# EasyEDA Pro project NFC-Card-D-export.epro

# Schematic NFC Card R1

## Sheets
1 01 USB and power: Assembly Variant: Basic; Board Name: Board1; Create Date: 2026-09-20; Page Name: P1; Project Name: NFC-Business-Card; Schematic Name: Schematic1; Update Date: 2026-09-20; Company: 嘉立创EDA; Page Size: A4; Version: V1.0
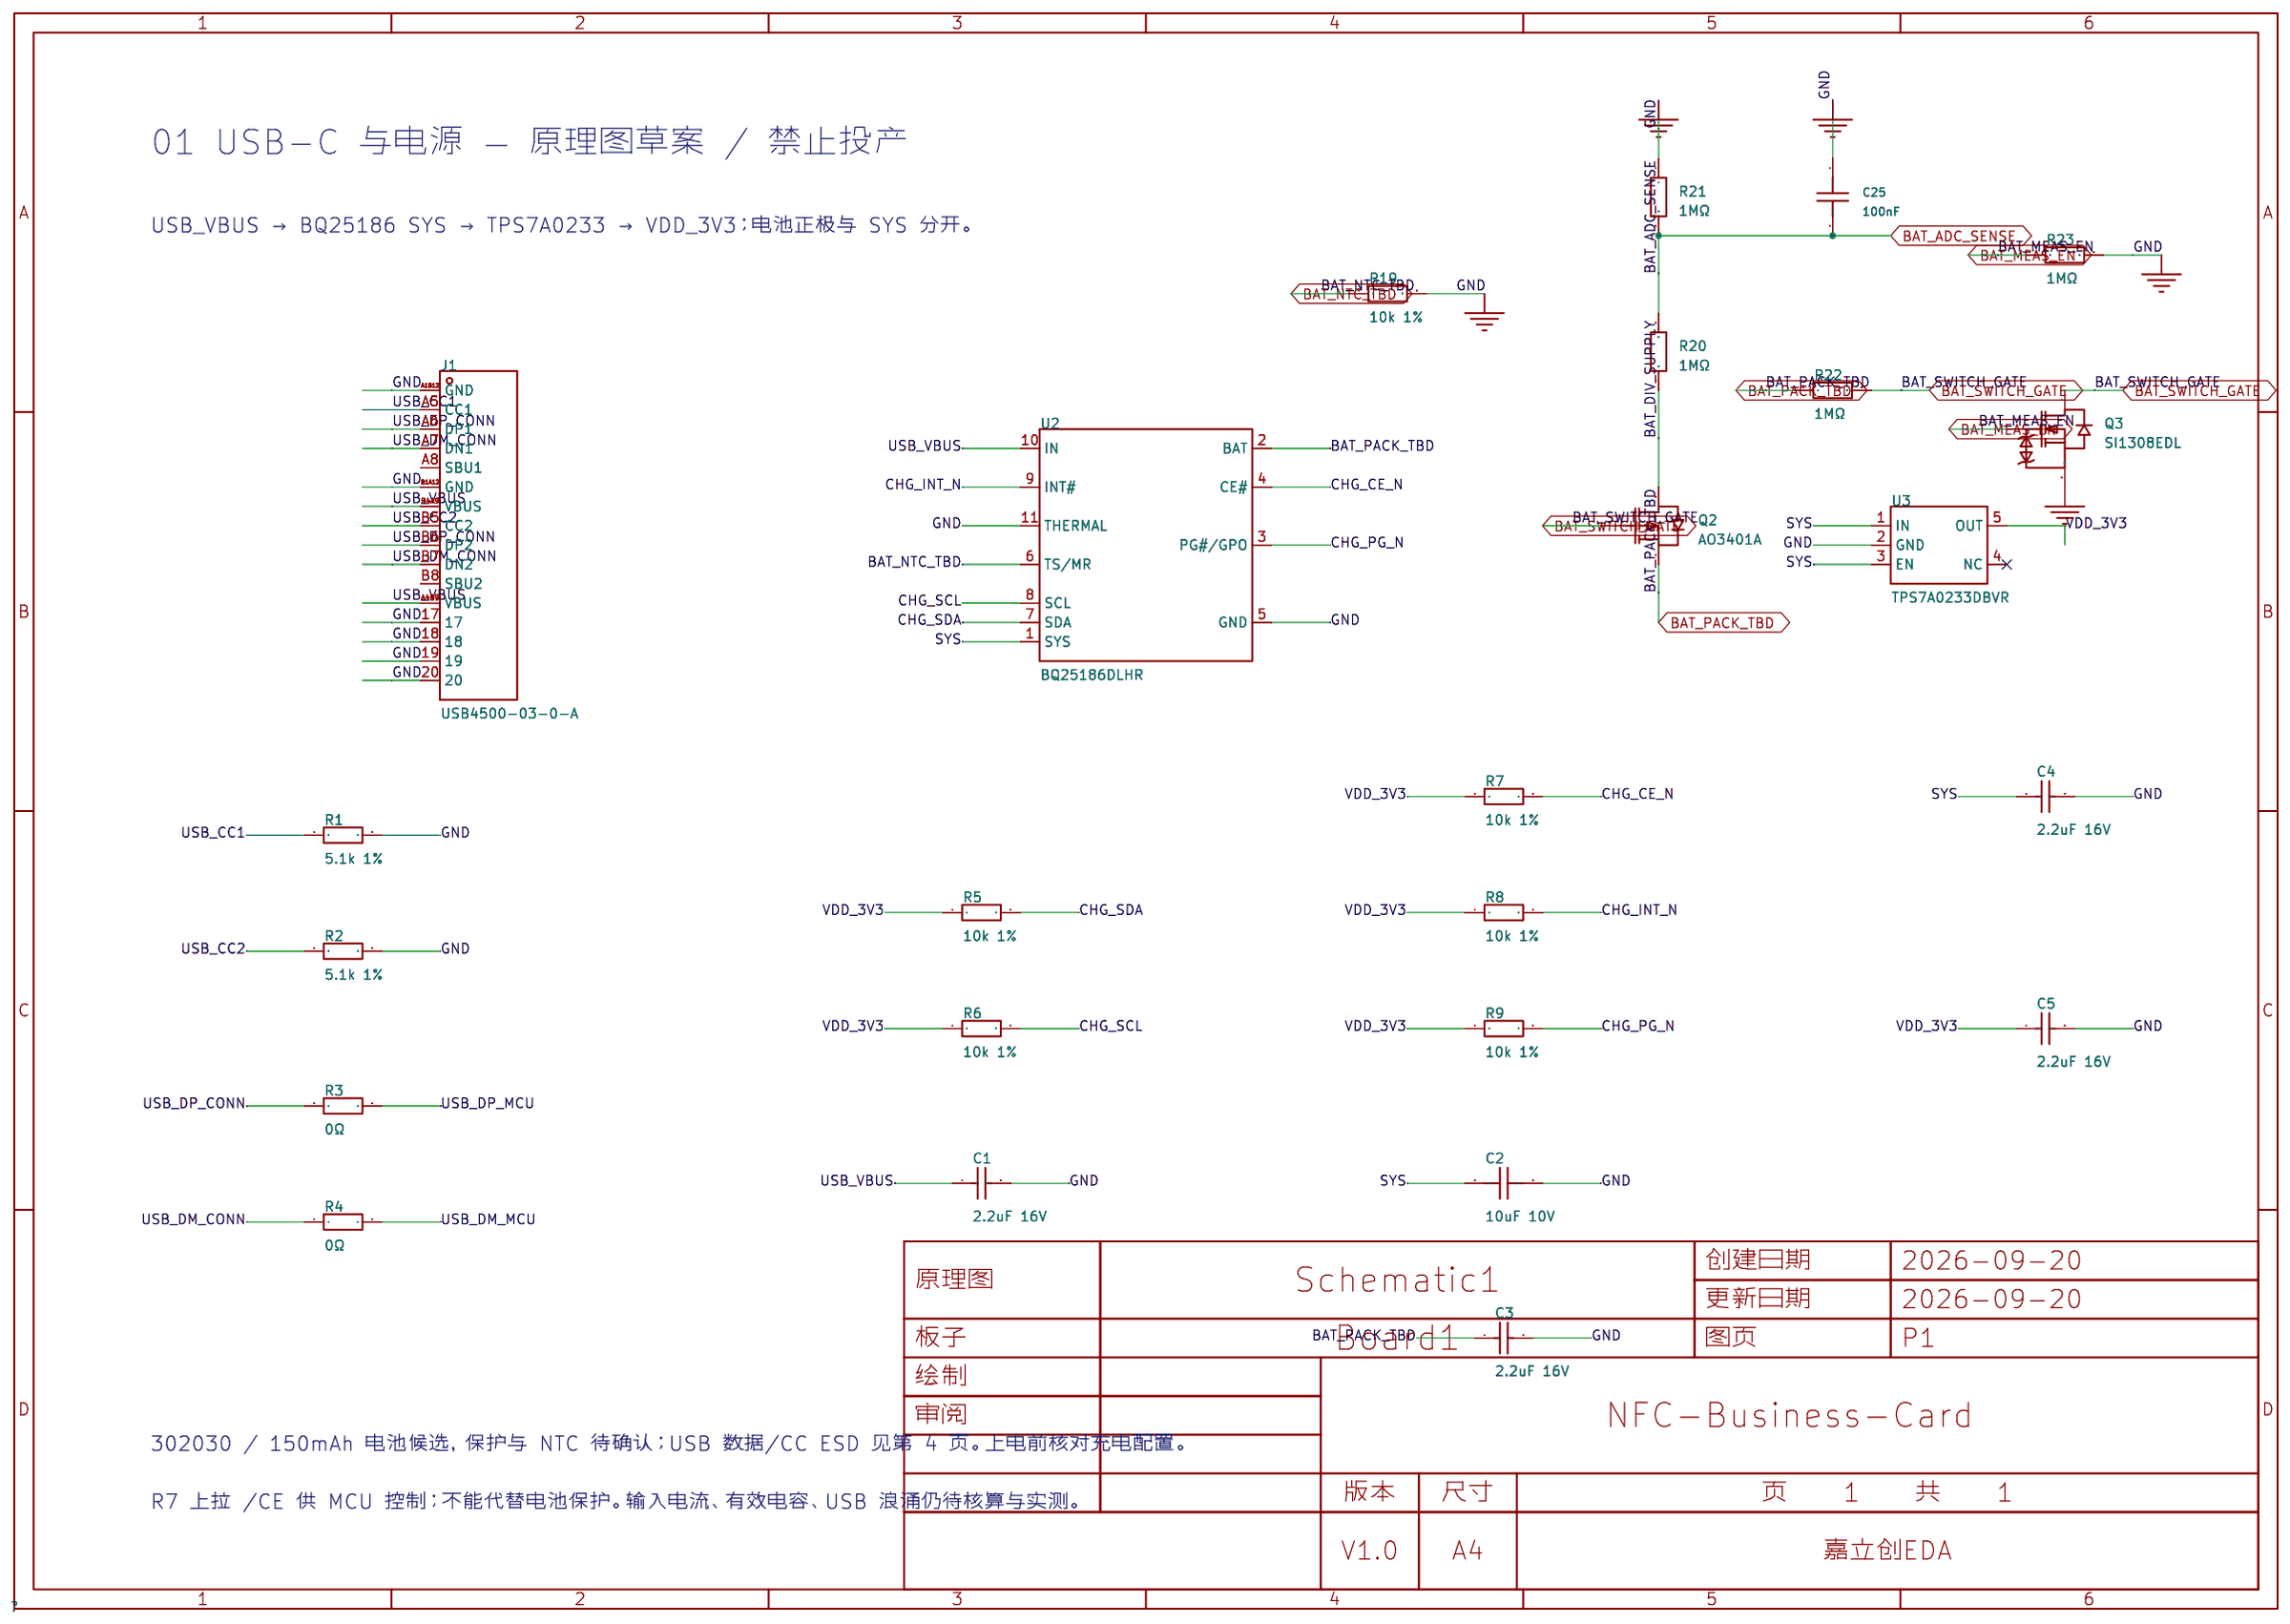
[diagram p0: 01 USB and power]
2 02 MCU and controls
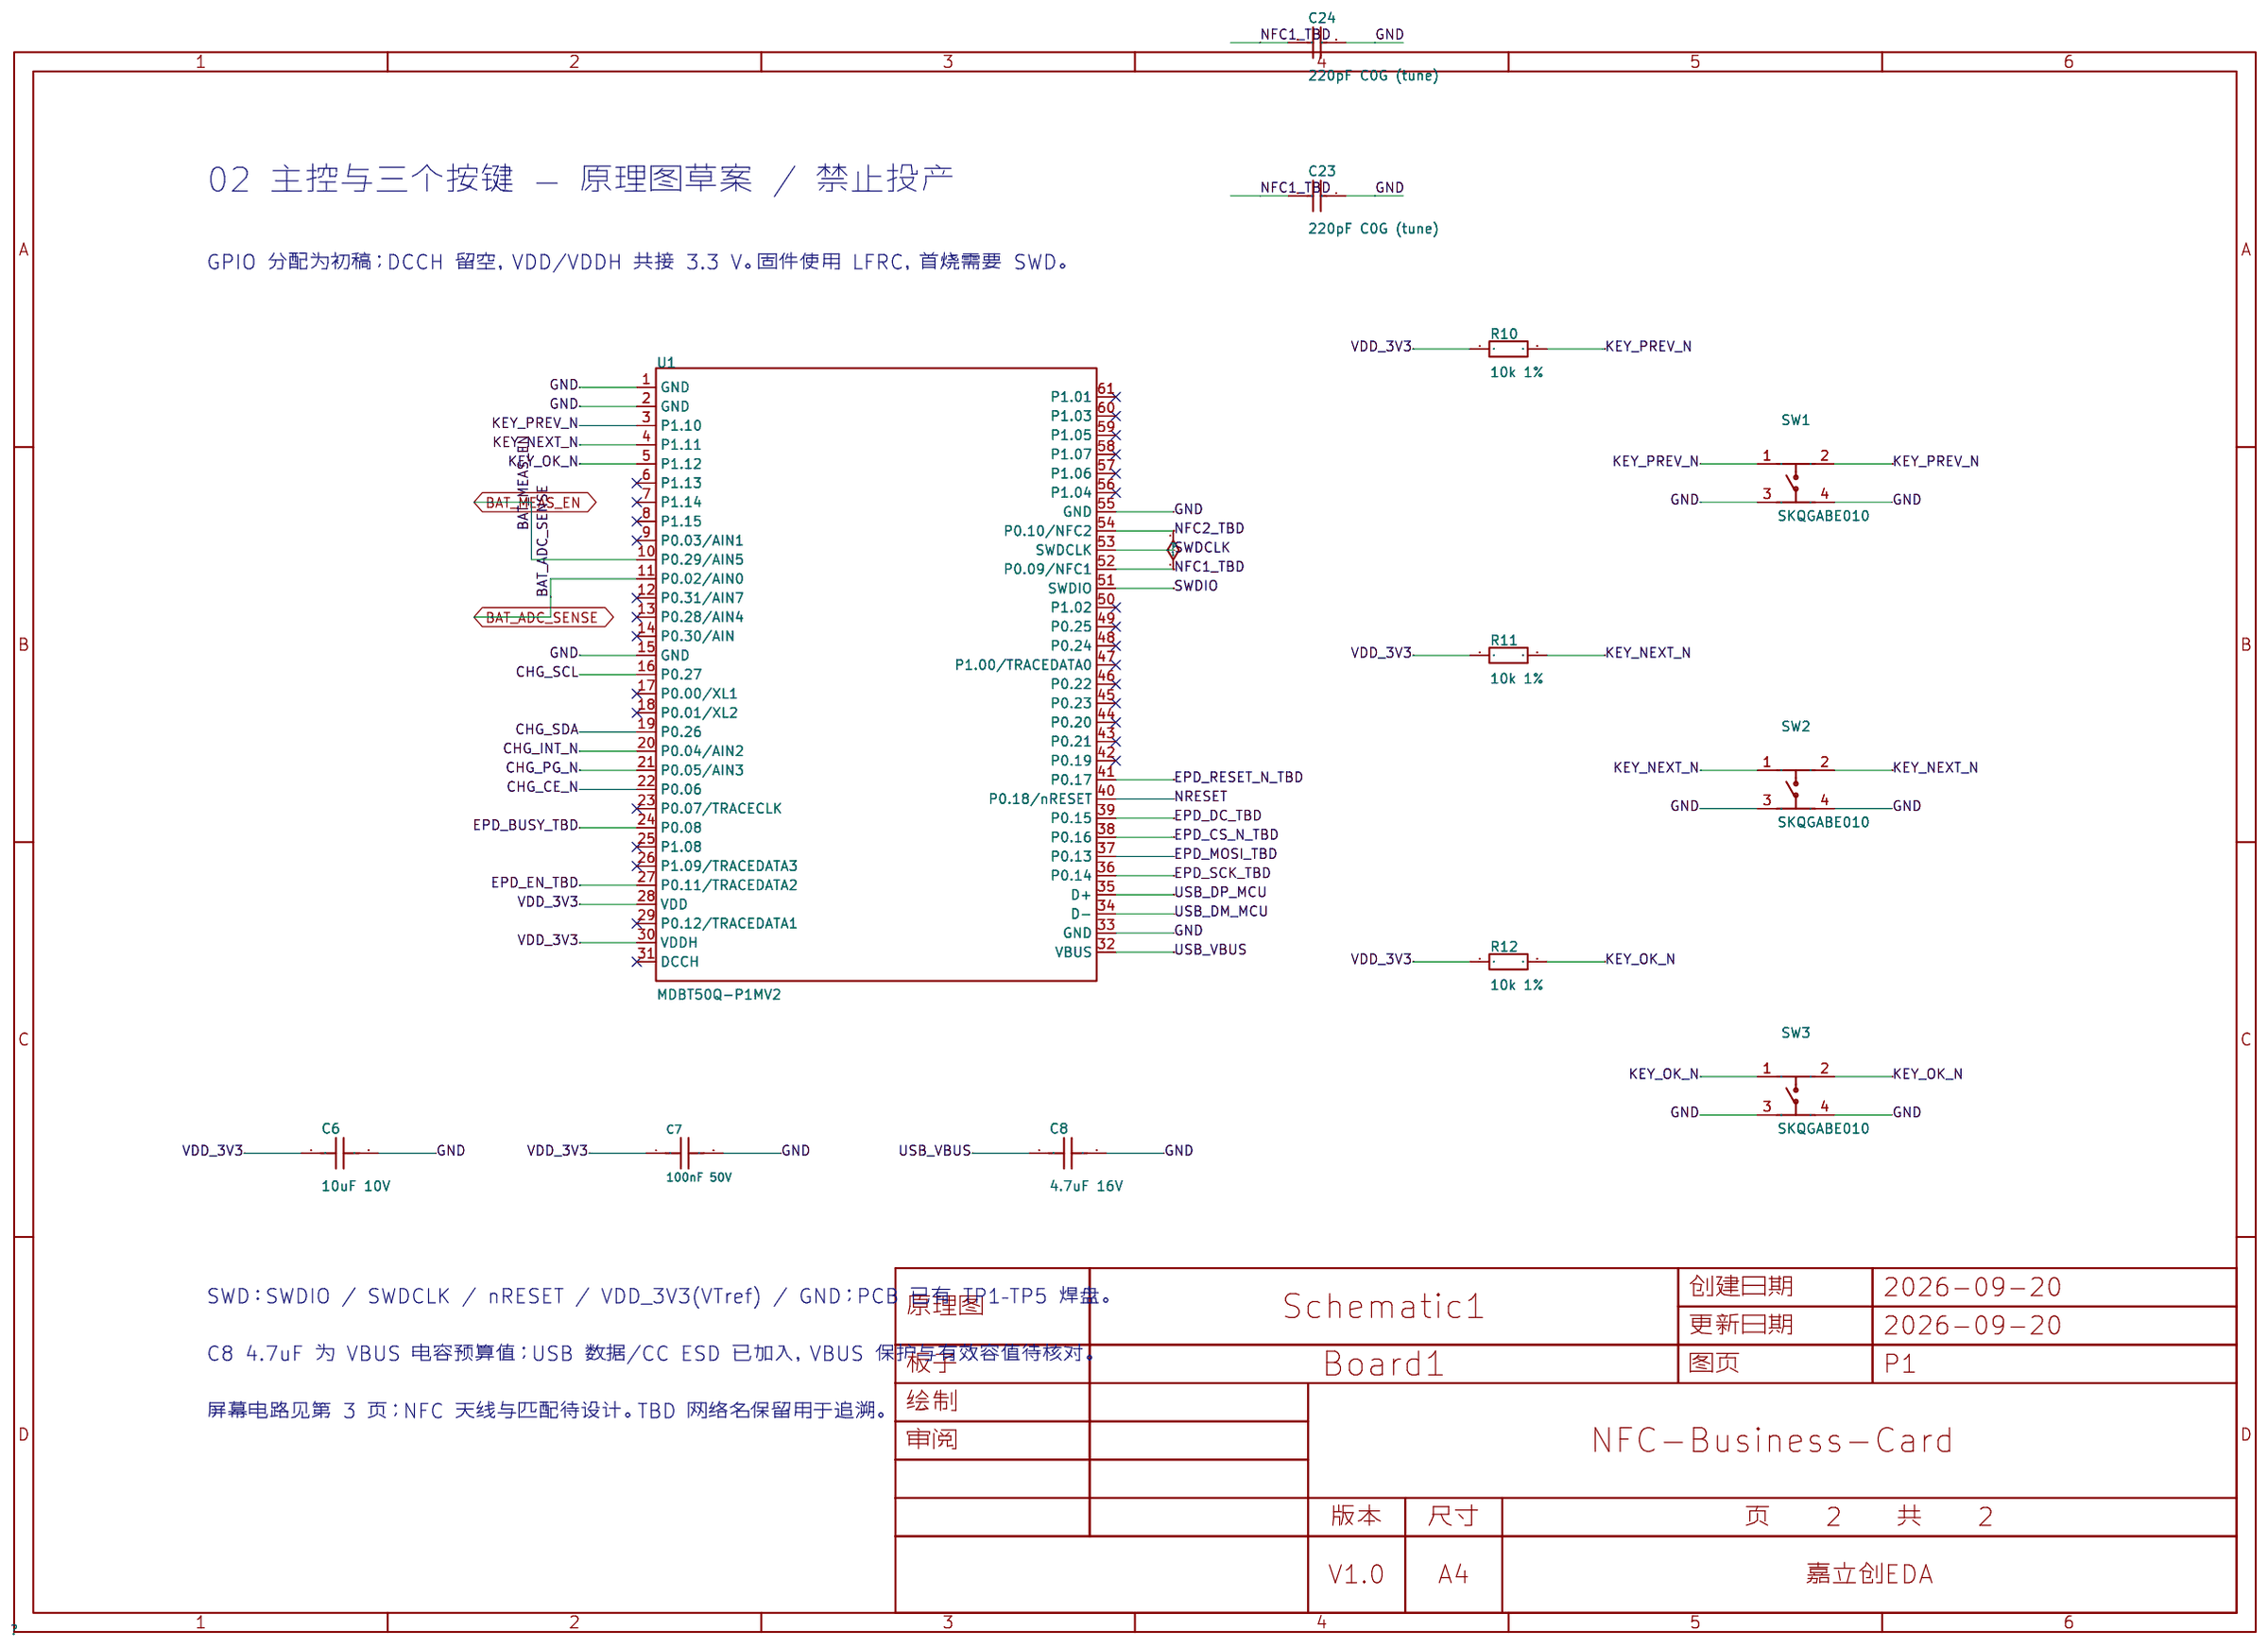
[diagram p1: 02 MCU and controls]
3 03 Display power and connector
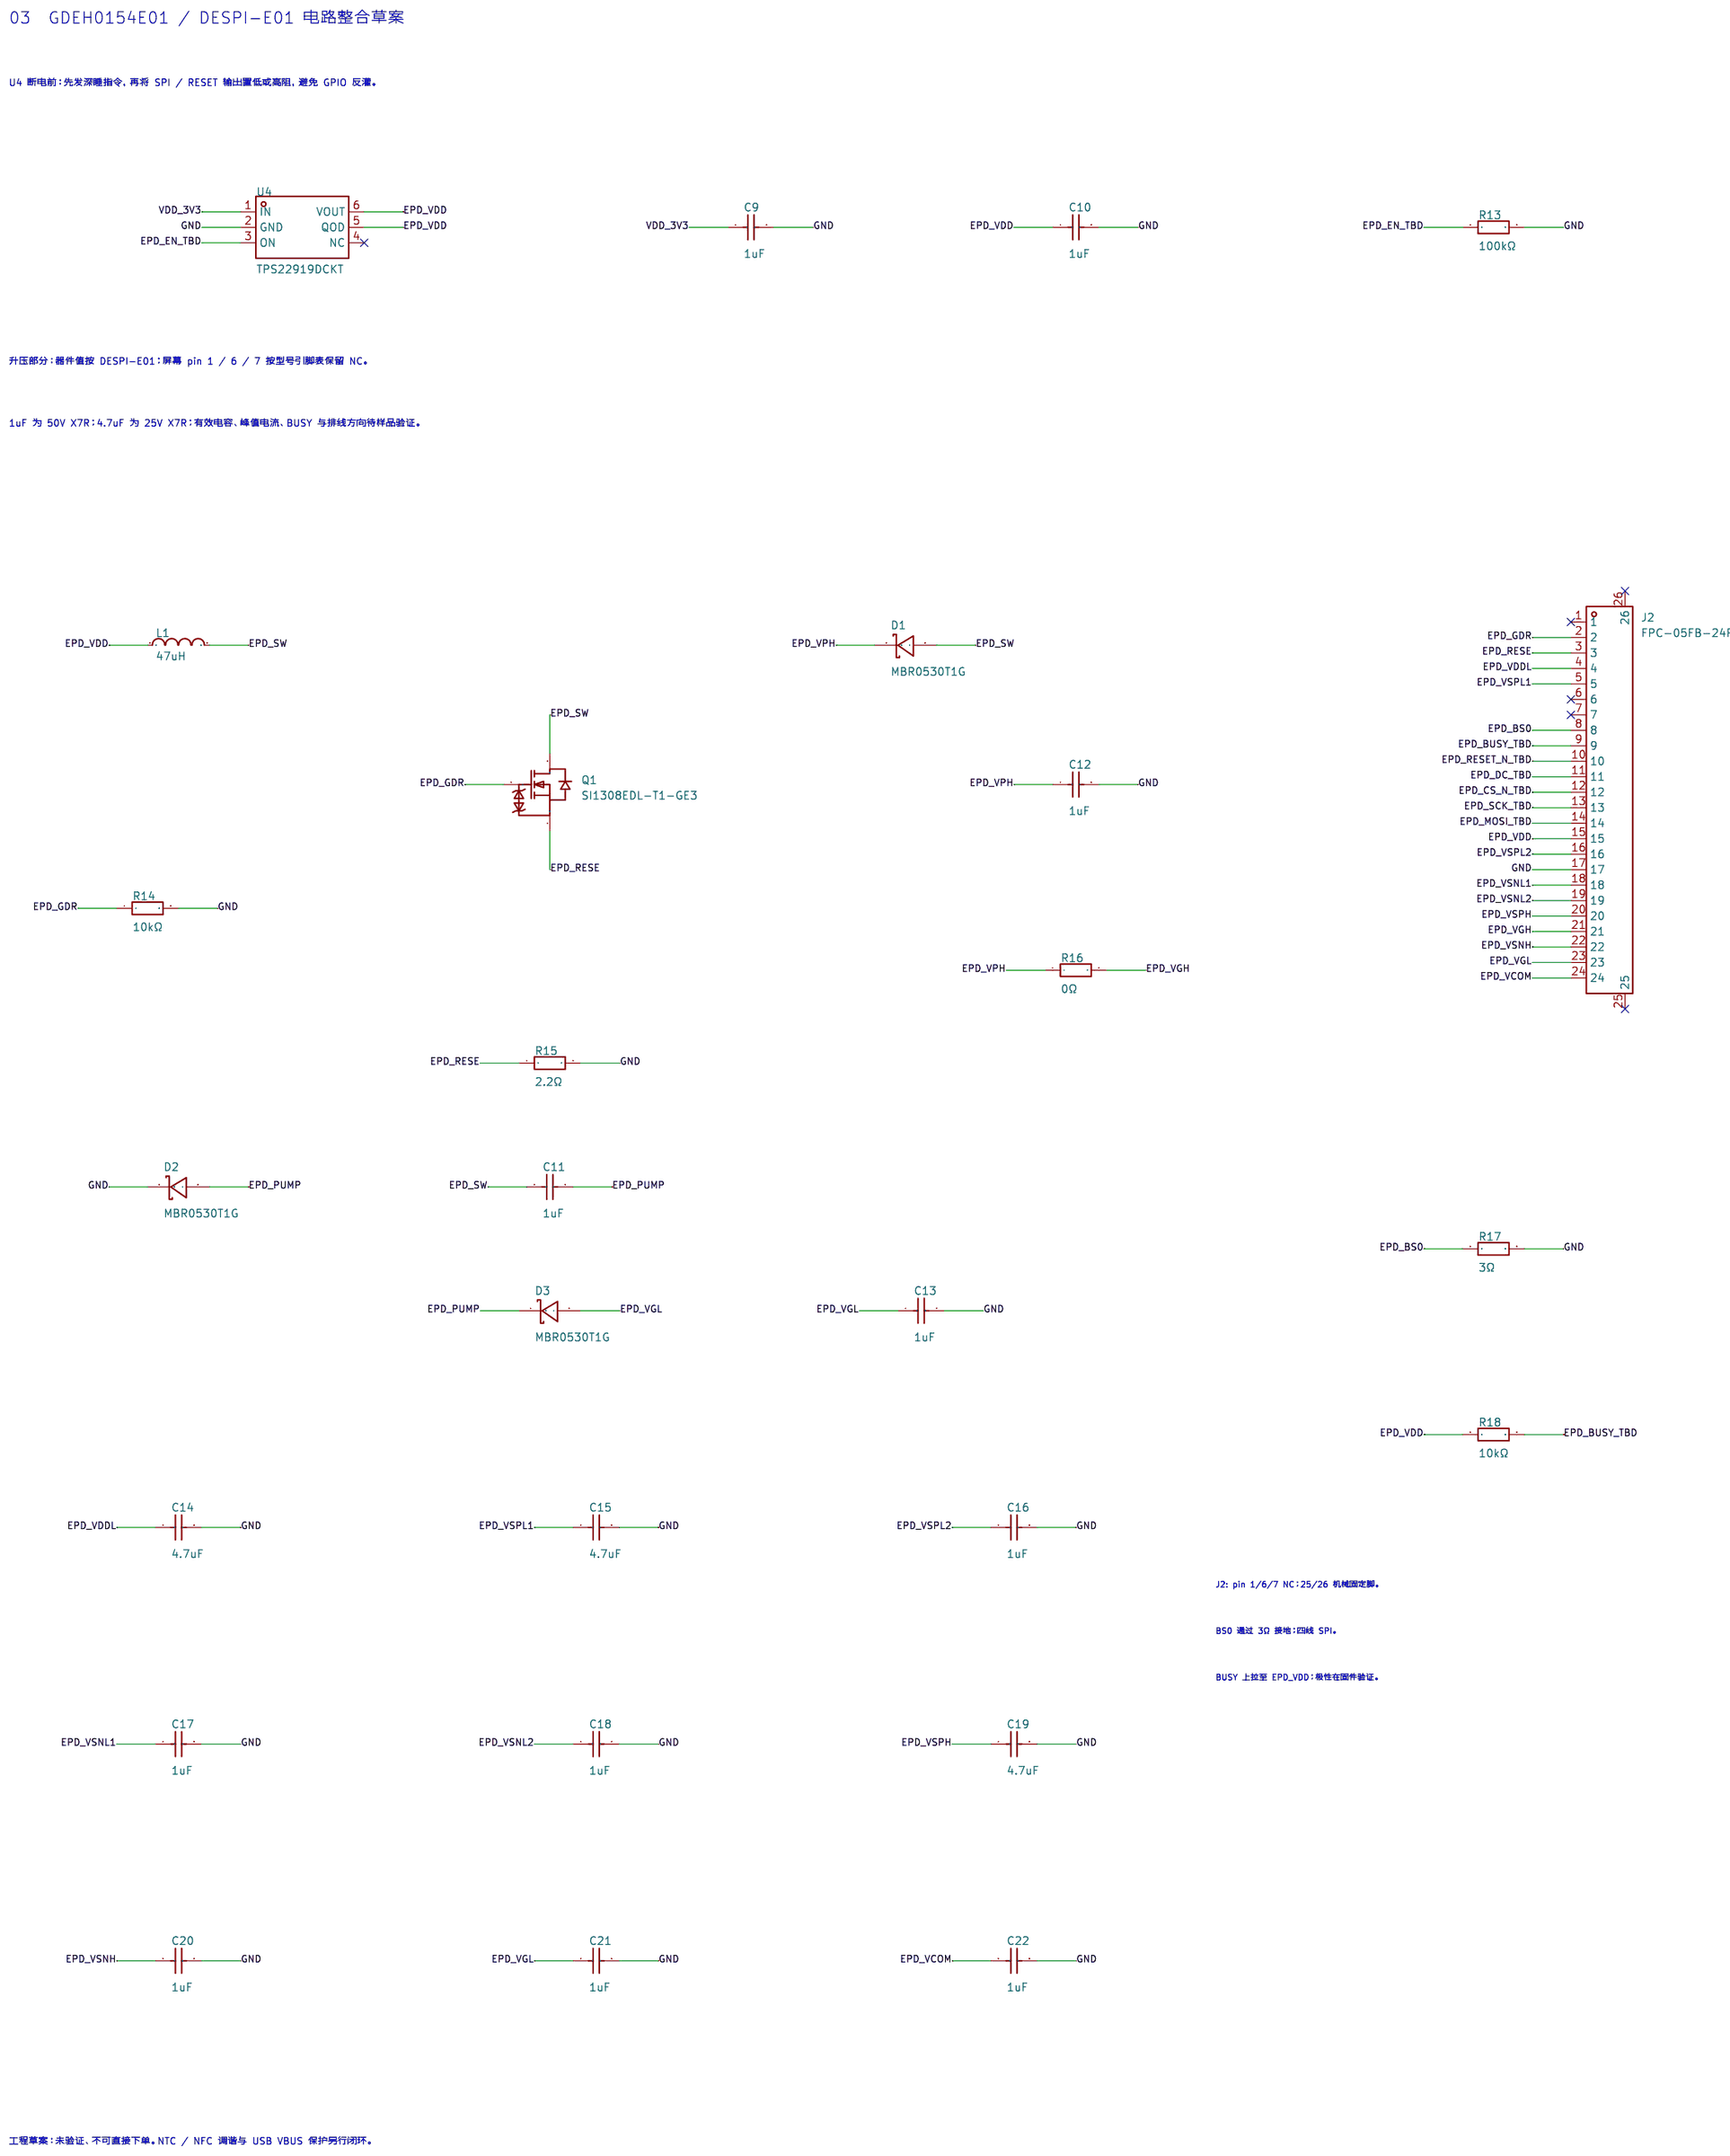
[diagram p2: 03 Display power and connector]
4 04 USB ESD and interfaces: Create Date: 2026-09-21; Project Name: NFC-Business-Card-84x52-E6; Update Date: 2026-09-21
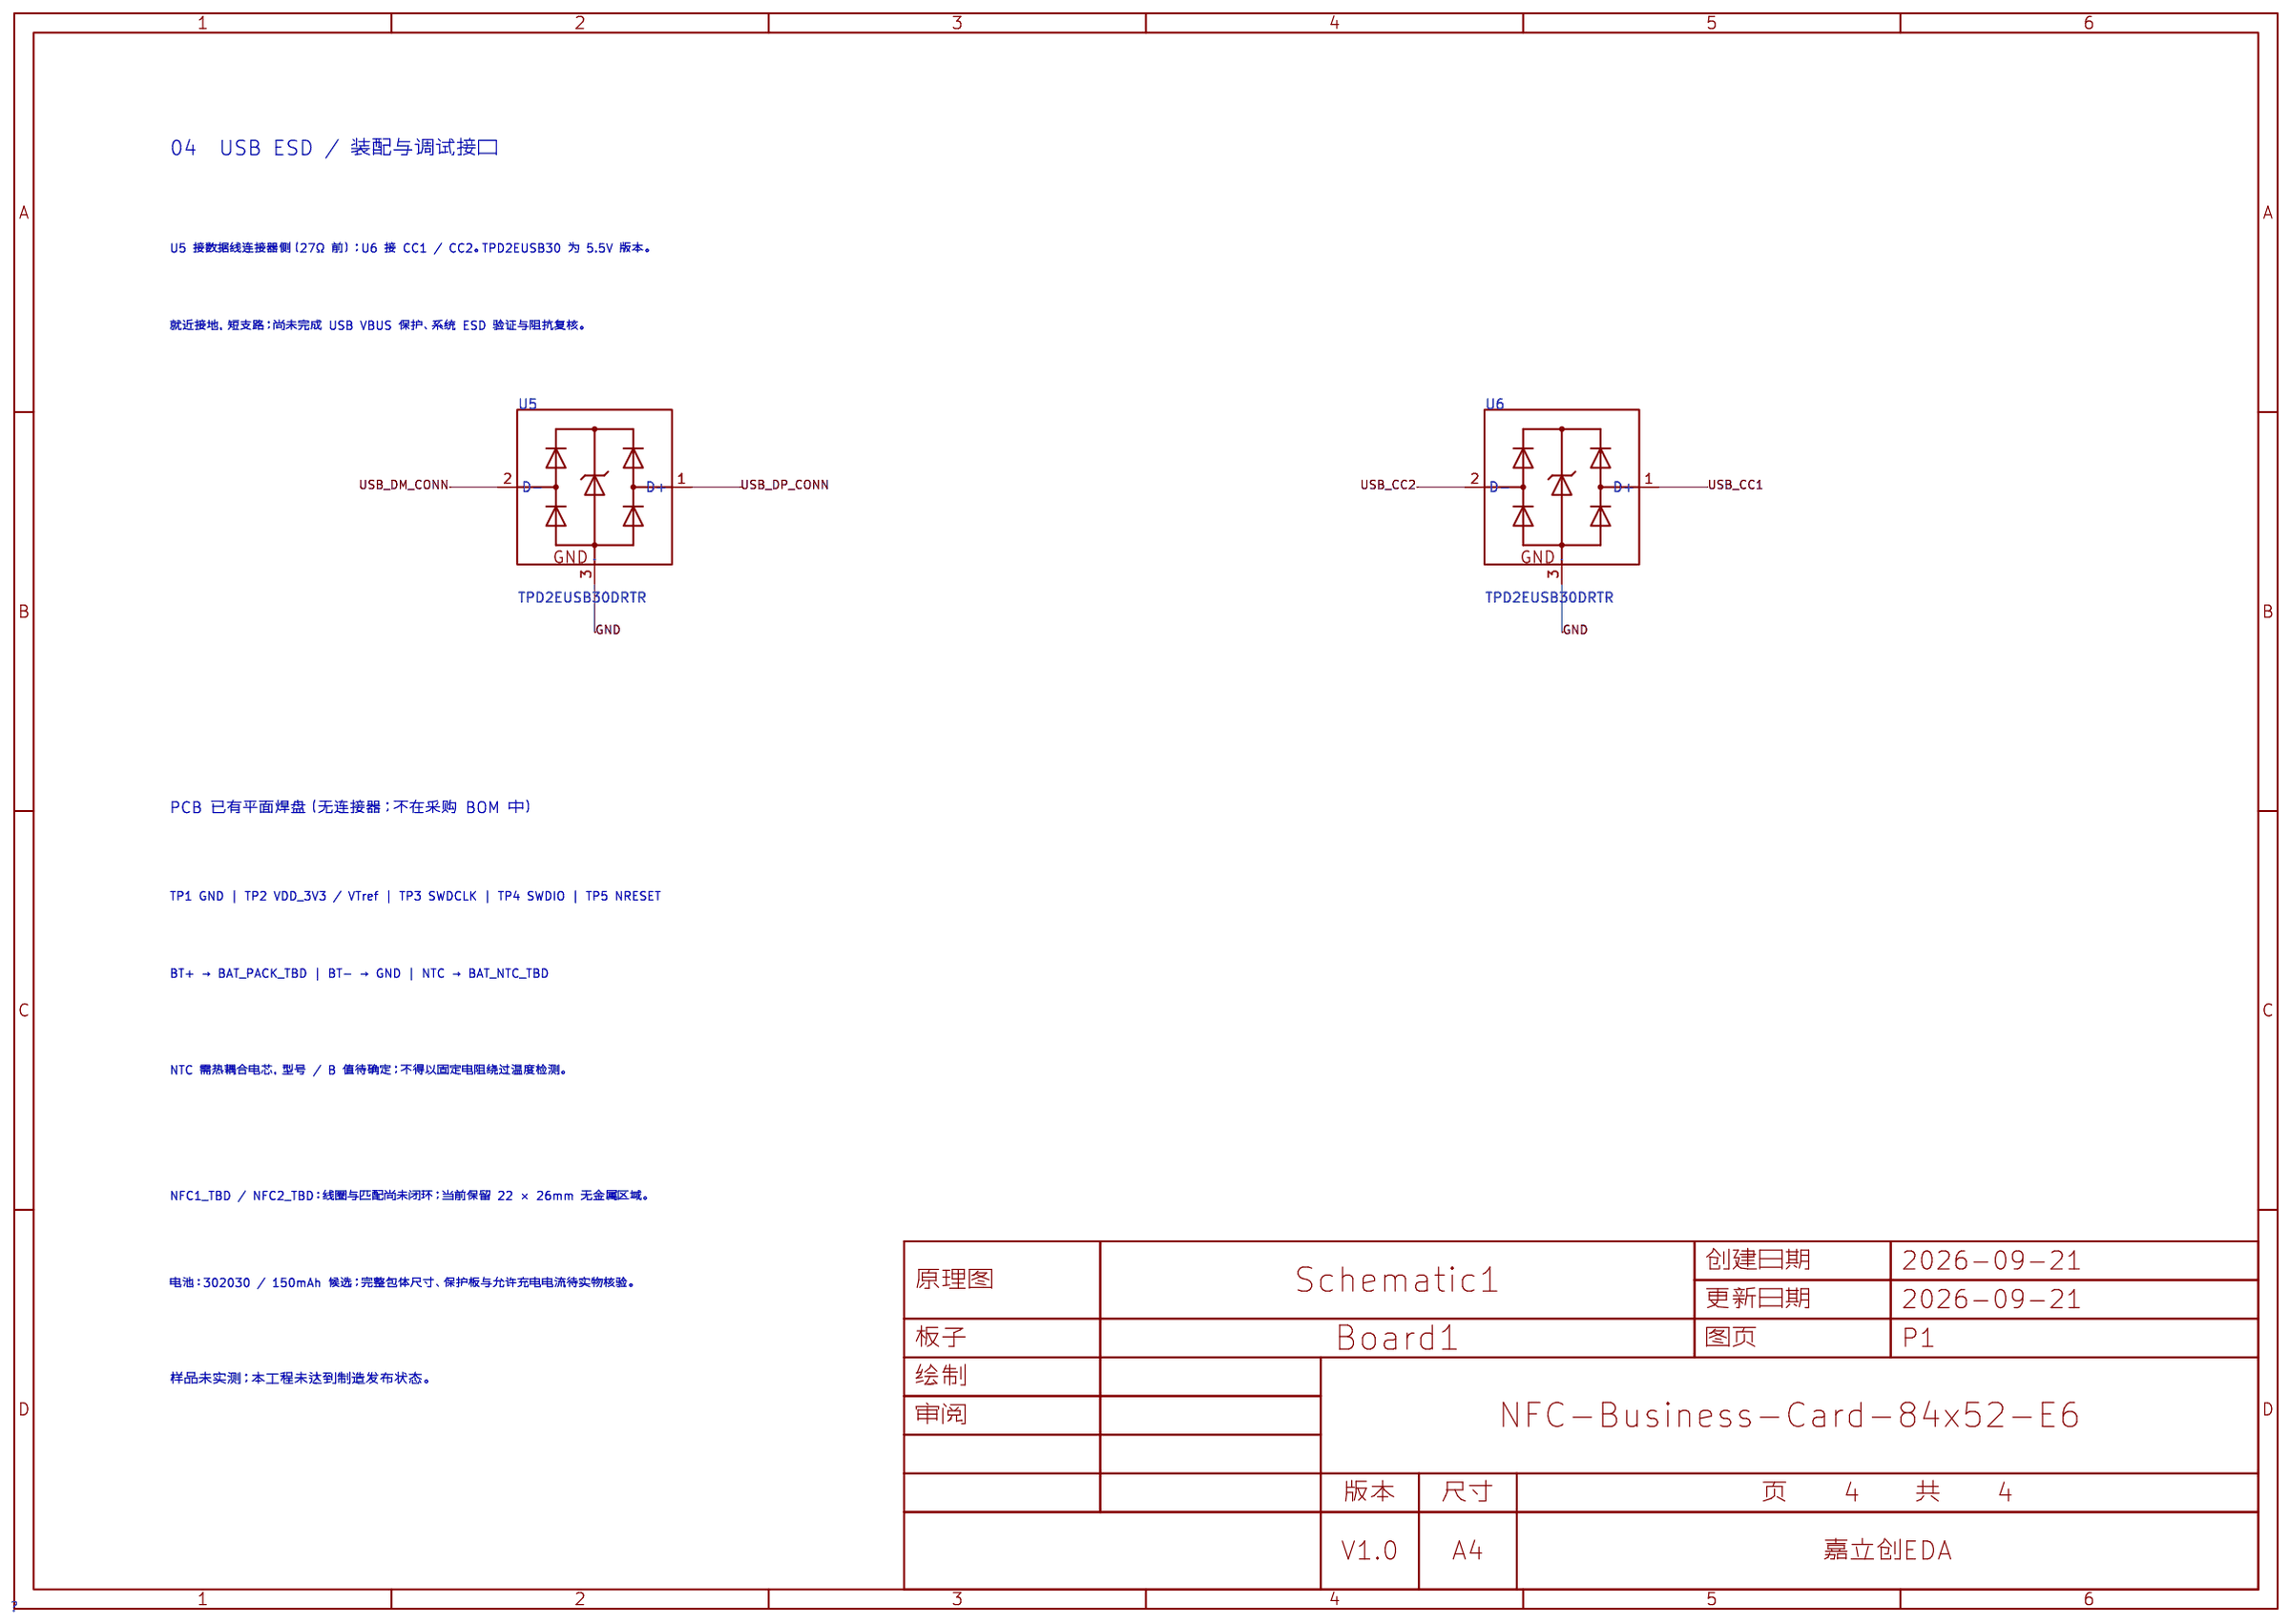
[diagram p3: 04 USB ESD and interfaces]

## Parts
sheet 01 USB and power
C1  2.2uF  [C0603]
C2  10uF  [C0603]
C3  2.2uF  [C0603]
C4  2.2uF  [C0603]
C5  2.2uF  [C0603]
C25  100nF  [C0603]
J1  USB4500-03-0-A  [USB-SMD_USB4500-03-0-A]
Q2  AO3401A  [SOT-23_L2.9-W1.3-P1.90-LS2.4-BR]
Q3  SI1308EDL  [SOT-323_L2.0-W1.3-P1.30-LS2.1-BR]
R1  5.1kΩ  [R0603]
R2  5.1kΩ  [R0603]
R3  0Ω  [R0603]
R4  0Ω  [R0603]
R5  10kΩ  [R0603]
R6  10kΩ  [R0603]
R7  10kΩ  [R0603]
R8  10kΩ  [R0603]
R9  10kΩ  [R0603]
R19  10kΩ  [R0603]
R20  1MΩ  [R0603]
R21  1MΩ  [R0603]
R22  1MΩ  [R0603]
R23  1MΩ  [R0603]
U2  BQ25186DLHR  [WSON-10_L2.2-W2.0-P0.40-BL-EP_TI_DLH0010A]
U3  TPS7A0233DBVR  [SOT-23-5_L2.9-W1.6-P0.95-LS2.8-BL]
sheet 02 MCU and controls
C6  10uF  [C0603]
C7  100nF  [C0603]
C8  4.7uF  [C0603]
C23  220pF  [C0603]
C24  220pF  [C0603]
R10  10kΩ  [R0603]
R11  10kΩ  [R0603]
R12  10kΩ  [R0603]
SW1  SKQGABE010  [KEY-SMD_4P-L5.2-W5.2-P3.70-LS6.4]
SW2  SKQGABE010  [KEY-SMD_4P-L5.2-W5.2-P3.70-LS6.4]
SW3  SKQGABE010  [KEY-SMD_4P-L5.2-W5.2-P3.70-LS6.4]
U1  MDBT50Q-P1MV2  [COMM-SMD_MDBT50Q-1MV2]
sheet 03 Display power and connector
C9  1uF  [C0805]
C10  1uF  [C0805]
C11  1uF  [C0805]
C12  1uF  [C0805]
C13  1uF  [C0805]
C14  4.7uF  [C0805]
C15  4.7uF  [C0805]
C16  1uF  [C0805]
C17  1uF  [C0805]
C18  1uF  [C0805]
C19  4.7uF  [C0805]
C20  1uF  [C0805]
C21  1uF  [C0805]
C22  1uF  [C0805]
D1  MBR0530T1G  [SOD-123_L2.7-W1.6-LS3.7-RD-1]
D2  MBR0530T1G  [SOD-123_L2.7-W1.6-LS3.7-RD-1]
D3  MBR0530T1G  [SOD-123_L2.7-W1.6-LS3.7-RD-1]
J2  FPC-05FB-24PH20  [FPC-SMD_24P-P0.50_FPC-05FB-24PH20]
L1  47uH  [IND-SMD_L3.0-W3.0]
Q1  SI1308EDL-T1-GE3  [SOT-323_L2.0-W1.3-P1.30-LS2.1-BR]
R13  100kΩ  [R0603]
R14  10kΩ  [R0603]
R15  2.2Ω  [R0603]
R16  0Ω  [R0603]
R17  3Ω  [R0603]
R18  10kΩ  [R0603]
U4  TPS22919DCKT  [SC-70-6_L2.0-W1.3-P0.65-LS2.1-BR]
sheet 04 USB ESD and interfaces
U5  TPD2EUSB30DRTR  [SOT-9X3-3_L1.0-W0.8-P0.35-LS1.0-BR]
U6  TPD2EUSB30DRTR  [SOT-9X3-3_L1.0-W0.8-P0.35-LS1.0-BR]

## Library data of the parts
C1 C3-C5 = CL10A225KO8NNNC: 容值:2.2uF;精度:±10%;额定电压:16V;温度系数:X5R;; LCSC Part Name: 2.2uF ±10% 16V; Supplier Part: C23630; Manufacturer: SAMSUNG(三星); Supplier Footprint: 0603; JLCPCB Part Class: Basic Part; Datasheet: https://item.szlcsc.com/datasheet/CL10A225KO8NNNC/24366.html; Supplier: LCSC; Tolerance: ±10%; Voltage Rating: 16V; Temperature Coefficient: X5R
C2 C6 = CL10A106KP8NNNC: 容值:10uF;精度:±10%;额定电压:10V;温度系数:X5R;; LCSC Part Name: 10uF ±10% 10V; Supplier Part: C19702; Manufacturer: SAMSUNG(三星); Supplier Footprint: 0603; JLCPCB Part Class: Basic Part; Datasheet: https://item.szlcsc.com/datasheet/CL10A106KP8NNNC/20411.html; Supplier: LCSC; Tolerance: ±10%; Voltage Rating: 10V; Temperature Coefficient: X5R
C7 C25 = CC0603KRX7R9BB104: 容值:100nF;精度:±10%;额定电压:50V;温度系数:X7R;; LCSC Part Name: 100nF ±10% 50V; Supplier Part: C14663; Manufacturer: YAGEO(国巨); Supplier Footprint: 0603; JLCPCB Part Class: Basic Part; Datasheet: https://item.szlcsc.com/datasheet/CC0603KRX7R9BB104/15331.html; Supplier: LCSC; Tolerance: ±10%; Voltage Rating: 50V; Temperature Coefficient: X7R
J1 = USB4500-03-0-A: 连接器类型:Type-C;协议标准:USB 2.0;公母:母;触点数量:24P;端口数量:1;额定电流 - 电源:5A;工作温度:-25℃~+85℃;; LCSC Part Name: Type-C 母; Supplier Part: C5354966; Manufacturer: GCT; Supplier Footprint: SMD; JLCPCB Part Class: Extended Part; Datasheet: https://item.szlcsc.com/datasheet/USB4500-03-0-A/6154270.html; Supplier: LCSC; Connector Type: Type-C; Protocol Standard: USB 2.0; Gender: 母; Number of Contacts: 24P; Number of Ports: 1; Current Rating-Power: 5A; Voltage Rating: 48V; Detection color: 黑色; Operating Temperature: -25℃~+85℃
Q2 = AO3401A_C15127: 数量:1个P沟道;漏源电压(Vdss):30V;连续漏极电流(Id):4A;导通电阻(RDS(on)):47mΩ@10V；85mΩ@2.5V；60mΩ@4.5V;耗散功率(Pd):-;阈值电压(Vgs(th)):900mV;; LCSC Part Name: 1个P沟道 耐压:30V 电流:4A; Supplier Part: C15127; Manufacturer: AOS; Supplier Footprint: SOT-23; JLCPCB Part Class: Basic Part; Datasheet: https://item.szlcsc.com/datasheet/AO3401A/15801.html; Supplier: LCSC; Number: 1个P沟道; Drain to Source Voltage: 30V; Current - Continuous Drain(Id): 4A; RDS(on): 47mΩ@10V；85mΩ@2.5V；60mΩ@4.5V; Gate Threshold Voltage (Vgs(th)): 900mV; Gate Charge(Qg): 14nC@10V; Input Capacitance(Ciss): 645pF; Reverse Transfer Capacitance (Crss@Vds): 55pF; Output Capacitance(Coss): 80pF
Q1 Q3 = SI1308EDL-T1-GE3: 数量:1个N沟道;漏源电压(Vdss):30V;连续漏极电流(Id):1.5A;导通电阻(RDS(on)):132mΩ@10V;耗散功率(Pd):400mW;阈值电压(Vgs(th)):1.5V;; LCSC Part Name: 1个N沟道 耐压:30V 电流:1.5A; Supplier Part: C469327; Manufacturer: VISHAY(威世); Supplier Footprint: SOT-323; JLCPCB Part Class: Extended Part; Datasheet: https://item.szlcsc.com/datasheet/SI1308EDL-T1-GE3/475518.html; Supplier: LCSC; Number: 1个N沟道; Drain to Source Voltage: 30V; Current - Continuous Drain(Id): 1.5A; RDS(on): 132mΩ@10V; Pd - Power Dissipation: 400mW; Gate Threshold Voltage (Vgs(th)): 1.5V; Gate Charge(Qg): 1.4nC@10V; Input Capacitance(Ciss): 105pF; Reverse Transfer Capacitance (Crss@Vds): 11pF; Operating Temperature: -55℃~+150℃; Type: N沟道; Output Capacitance(Coss): 23pF; Vgs: ±12V
R1 R2 = 0603WAF5101T5E: 电阻类型:厚膜电阻;阻值:5.1kΩ;精度:±1%;功率:100mW;工作电压:75V;温度系数:±100ppm/℃;; LCSC Part Name: 厚膜电阻 5.1kΩ ±1%; Supplier Part: C23186; Manufacturer: UNI-ROYAL(厚声); Supplier Footprint: 0603; JLCPCB Part Class: Basic Part; Datasheet: https://item.szlcsc.com/datasheet/0603WAF5101T5E/23913.html; Supplier: LCSC; Type: 厚膜电阻; Tolerance: ±1%; Power(Watts): 100mW; Voltage-Supply(Max): 75V; Temperature Coefficient: ±100ppm/℃; Operating Temperature: -55℃~+155℃
R3 R4 = RMC0603271%N: 阻值:27Ω;精度:±1%;功率:100mW;; LCSC Part Name: 厚膜电阻 0Ω ±1%; Supplier Part: C21189; Manufacturer: UNI-ROYAL(厚声); Manufacturer Part: 0603WAF0000T5E; Supplier Footprint: 0603; JLCPCB Part Class: Basic Part; Datasheet: https://item.szlcsc.com/datasheet/0603WAF0000T5E/21903.html; Supplier: LCSC; Tolerance: ±1%; Power(Watts): 100mW; Type: 厚膜电阻; Voltage-Supply(Max): 75V; Operating Temperature: -55℃~+155℃
R5-R12 R14 R18 R19 = 0603WAF1002T5E: 电阻类型:厚膜电阻;阻值:10kΩ;精度:±1%;功率:100mW;工作电压:75V;温度系数:±100ppm/℃;; LCSC Part Name: 厚膜电阻 10kΩ ±1% 100mW; Supplier Part: C25804; Manufacturer: UNI-ROYAL(厚声); Supplier Footprint: 0603; JLCPCB Part Class: Basic Part; Datasheet: https://item.szlcsc.com/datasheet/0603WAF1002T5E/26547.html; Supplier: LCSC; Type: 厚膜电阻; Tolerance: ±1%; Power(Watts): 100mW; Voltage-Supply(Max): 75V; Temperature Coefficient: ±100ppm/℃; Operating Temperature: -55℃~+155℃
R20-R23 = 0603WAF1004T5E: 电阻类型:厚膜电阻;阻值:1MΩ;精度:±1%;功率:100mW;工作电压:75V;温度系数:±100ppm/℃;; LCSC Part Name: 1MΩ ±1% 100mW 厚膜电阻; Supplier Part: C22935; Manufacturer: UNI-ROYAL(厚声); Supplier Footprint: 0603; JLCPCB Part Class: Basic Part; Datasheet: https://item.szlcsc.com/datasheet/0603WAF1004T5E/23662.html; Supplier: LCSC; Type: 厚膜电阻; Tolerance: ±1%; Power(Watts): 100mW; Voltage-Supply(Max): 75V; Temperature Coefficient: ±100ppm/℃; Operating Temperature: -55℃~+155℃
U2 = BQ25186DLHR_C44639442: 工作电压:3.6V~18V;最大充电电流:1A;电池类型:磷酸铁锂电池；锂电池;电池节数:1;; LCSC Part Name: 单节电池1A IC线性电池充电器，具有电源路径、运输模式、关断模式和电池跟踪VINDPM; Supplier Part: C44639442; Manufacturer: TI(德州仪器); Supplier Footprint: WSON-10; JLCPCB Part Class: Extended Part; Datasheet: https://www.ti.com.cn/cn/lit/ds/symlink/bq25186.pdf; Supplier: LCSC; The Chip Type: 充电芯片; Voltage - Supply: 3.6V~18V; Charge Current - Max: 1A; Charging Saturation Voltage: 4.65V; End-Off Voltage: 2V; Type of Battery: 磷酸铁锂电池；锂电池; Number of Cells: 1; Operating Temperature: -40℃~+125℃; Battery Temperature Detection: 支持; 0V Battery Charge: 支持; Supply Current (Iq): 15nA; Interface: I2C
U3 = TPS7A0233DBVR: 输出极性:正极;工作电压:6V;输出电压:3.3V;输出电流:200mA;电源纹波抑制比(PSRR):55dB@(1kHz);输出类型:固定;; LCSC Part Name: 3.3V 200mA 6V; Supplier Part: C5142805; Manufacturer: TI(德州仪器); Supplier Footprint: SOT-23-5; JLCPCB Part Class: Extended Part; Datasheet: https://www.ti.com/cn/lit/ds/symlink/tps7a02.pdf; Supplier: LCSC; Output Configuration: 正极; Voltage - Supply: 6V; Output Voltage: 3.3V; Output Current: 200mA; Power Supply Rejection Ratio (PSRR): 55dB@(1kHz); Voltage Dropout: 270mV@(200mA); standby current: 25nA; Noise: 130uVrms; Features: 使能控制；过流保护；输出放电；热关断；输入欠压保护; Operating Temperature: -40℃~+125℃@(Tj); Output Type: 固定; Number of Outputs: 1
C8 = CL10A475KO8NNNC: 容值:4.7uF;精度:±10%;额定电压:16V;温度系数:X5R;; LCSC Part Name: 4.7uF ±10% 16V; Supplier Part: C19666; Manufacturer: SAMSUNG(三星); Supplier Footprint: 0603; JLCPCB Part Class: Basic Part; Datasheet: https://item.szlcsc.com/datasheet/CL10A475KO8NNNC/20375.html; Supplier: LCSC; Tolerance: ±10%; Voltage Rating: 16V; Temperature Coefficient: X5R
C23 C24 = GRM1885C1H221JA01D: 容值:220pF;精度:±5%;额定电压:50V;材质(温度系数):C0G;; LCSC Part Name: 220pF ±5% 50V; Supplier Part: C77032; Manufacturer: muRata(村田); Supplier Footprint: 0603; JLCPCB Part Class: Extended Part; Datasheet: https://atta.szlcsc.com/upload/public/pdf/source/20200305/C490387_23319AE8C154DEB24C505E6C82A8106A.pdf; Supplier: LCSC; Tolerance: ±5%; Voltage Rated: 50V; Temperature Coefficient: C0G; RF Status: Prototype value; retune after measurement
SW1-SW3 = SKQGABE010: 电路结构:单刀单掷;按钮形状:圆形按钮;安装方式:立贴;开关长度:5.2mm;开关宽度:5.2mm;开关高度:1.5mm;触点电流:50mA;额定电压:12V;带灯:-;工作寿命:-;; LCSC Part Name: 5.2*5.2*1.5mm 立贴 轻触开关; Supplier Part: C115351; Manufacturer: ALPSALPINE(阿尔卑斯阿尔派); Supplier Footprint: SMD-4P,5.2x5.2mm; JLCPCB Part Class: Extended Part; Datasheet: https://item.szlcsc.com/datasheet/SKQGABE010/116599.html; Supplier: LCSC; Circuit: 单刀单掷; Actuator Style: 圆形按钮; Mounting Type: 立贴; Length: 5.2mm; Width: 5.2mm; Switch Height: 1.5mm; Contact Current: 50mA; Voltage Rating: 12V
U1 = MDBT50Q-P1MV2: 是一个基于Nordic nRF52840 SoC解决方案设计的BT 5.2协议栈（低功耗蓝牙或BLE）模块，集成了GPIO、SPI、UART、I2C、I2S、PMD、PWM、ADC、NFC和USB接口，用于连接外设和传感器。; LCSC Part Name: 蓝牙低功耗模块; Supplier Part: C5119772; Manufacturer: RAYTAC; Supplier Footprint: SMD-61P; JLCPCB Part Class: Extended Part; Datasheet: https://item.szlcsc.com/datasheet/MDBT50Q-P1MV2/5703459.html; Supplier: LCSC; Features: 加密功能；Mesh组网
C9-C13 C16-C18 C20-C22 = CL21B105KBFNNNE: 容值:1uF;精度:±10%;额定电压:50V;温度系数:X7R;; LCSC Part Name: 1uF ±10% 50V; Supplier Part: C28323; Manufacturer: SAMSUNG(三星); Supplier Footprint: 0805; JLCPCB Part Class: Basic Part; Datasheet: https://item.szlcsc.com/datasheet/CL21B105KBFNNNE/29074.html; Supplier: LCSC; Tolerance: ±10%; Voltage Rating: 50V; Temperature Coefficient: X7R
C14 C15 C19 = CL21B475KAFNNNE: 容值:4.7uF;精度:±10%;额定电压:25V;温度系数:X7R;; LCSC Part Name: 4.7uF ±10% 25V; Supplier Part: C98195; Manufacturer: SAMSUNG(三星); Supplier Footprint: 0805; JLCPCB Part Class: Extended Part; Datasheet: https://item.szlcsc.com/datasheet/CL21B475KAFNNNE/99404.html; Supplier: LCSC; Tolerance: ±10%; Voltage Rating: 25V; Temperature Coefficient: X7R
D1-D3 = MBR0530T1G: 正向压降(Vf):430mV@500mA;直流反向耐压(Vr):30V;整流电流:500mA;; LCSC Part Name: 电压:30V 电流:500mA; Supplier Part: C82046; Manufacturer: onsemi(安森美); Supplier Footprint: SOD-123; JLCPCB Part Class: Extended Part; Datasheet: https://item.szlcsc.com/datasheet/MBR0530T1G/83201.html; Supplier: LCSC; Voltage - Forward(Vf@If): 430mV@500mA; Voltage - DC Reverse(Vr): 30V; Current - Rectified: 500mA; Reverse Leakage Current (Ir): 130uA@30V; Operating Junction Temperature Range: -65℃~+125℃; Non-Repetitive Peak Forward Surge Current: 5.5A
J2 = FPC-05FB-24PH20: 锁定特性:翻盖式;触点类型:双侧触点/上下接;触点数量:24P;间距:0.5mm;安装方式:卧贴;工作温度:-25℃~+85℃;; LCSC Part Name: 翻盖式 双侧触点/上下接 P数:24P 间距:0.5mm; Supplier Part: C2856831; Manufacturer: XUNPU(讯普); Supplier Footprint: SMD,P=0.5mm,卧贴; JLCPCB Part Class: Extended Part; Datasheet: https://item.szlcsc.com/datasheet/FPC-05FB-24PH20/3056929.html; Supplier: LCSC; Locking Feature: 翻盖式; Contact Type: 双侧触点/上下接; Number of Contacts: 24P; Pitch: 0.5mm; Mounting Type: 卧贴; FFC, FCB Thickness: 0.3mm; Height Above Board: 2mm; Contact Material: 磷青铜; Contact Plating: 锡; Operating Temperature: -25℃~+85℃; Rated Voltage (Max): 50V; Current Rating (Max): 500mA
L1 = NRH3010T470MN: 电感值:47uH;精度:±20%;额定电流:250mA;饱和电流(Isat):250mA;类型:-;; LCSC Part Name: 47uH ±20% 250mA; Supplier Part: C223116; Manufacturer: TAIYO YUDEN(太诱); Supplier Footprint: SMD,3x3mm; JLCPCB Part Class: Extended Part; Datasheet: https://atta.szlcsc.com/upload/public/pdf/source/20190329/C222848_0E03677360B3A1898B651728462F6FFE.pdf; Supplier: LCSC; Tolerance: ±20%; Rated Current: 250mA; Saturation Current (Isat): 250mA; DC Resistance (DCR): 2.46Ω
R13 = 0603WAF1003T5E: 电阻类型:厚膜电阻;阻值:100kΩ;精度:±1%;功率:100mW;工作电压:75V;温度系数:±100ppm/℃;; LCSC Part Name: 厚膜电阻 100kΩ ±1%; Supplier Part: C25803; Manufacturer: UNI-ROYAL(厚声); Supplier Footprint: 0603; JLCPCB Part Class: Basic Part; Datasheet: https://item.szlcsc.com/datasheet/0603WAF1003T5E/26546.html; Supplier: LCSC; Type: 厚膜电阻; Tolerance: ±1%; Power(Watts): 100mW; Voltage-Supply(Max): 75V; Temperature Coefficient: ±100ppm/℃; Operating Temperature: -55℃~+155℃
R15 = 0603WAF220KT5E: 电阻类型:厚膜电阻;阻值:2.2Ω;精度:±1%;功率:100mW;工作电压:75V;温度系数:±400ppm/℃;; LCSC Part Name: 厚膜电阻 2.2Ω ±1%; Supplier Part: C22939; Manufacturer: UNI-ROYAL(厚声); Supplier Footprint: 0603; JLCPCB Part Class: Basic Part; Datasheet: https://item.szlcsc.com/datasheet/0603WAF220KT5E/23666.html; Supplier: LCSC; Type: 厚膜电阻; Tolerance: ±1%; Power(Watts): 100mW; Voltage-Supply(Max): 75V; Temperature Coefficient: ±400ppm/℃; Operating Temperature: -55℃~+155℃
R16 = 0603WAF0000T5E: 电阻类型:厚膜电阻;阻值:0Ω;精度:±1%;功率:100mW;工作电压:75V;温度系数:-;; LCSC Part Name: 厚膜电阻 0Ω ±1%; Supplier Part: C21189; Manufacturer: UNI-ROYAL(厚声); Supplier Footprint: 0603; JLCPCB Part Class: Basic Part; Datasheet: https://item.szlcsc.com/datasheet/0603WAF0000T5E/21903.html; Supplier: LCSC; Type: 厚膜电阻; Tolerance: ±1%; Power(Watts): 100mW; Voltage-Supply(Max): 75V; Operating Temperature: -55℃~+155℃
R17 = 0603WAF300KT5E: 电阻类型:厚膜电阻;阻值:3Ω;精度:±1%;功率:100mW;工作电压:75V;温度系数:±200ppm/℃;; LCSC Part Name: 厚膜电阻 3Ω ±1%; Supplier Part: C23157; Manufacturer: UNI-ROYAL(厚声); Supplier Footprint: 0603; JLCPCB Part Class: Extended Part; Datasheet: https://item.szlcsc.com/datasheet/0603WAF300KT5E/23884.html; Supplier: LCSC; Type: 厚膜电阻; Tolerance: ±1%; Power(Watts): 100mW; Voltage-Supply(Max): 75V; Temperature Coefficient: ±200ppm/℃; Operating Temperature: -55℃~+155℃
U4 = TPS22919DCKT: 类型:负载开关;通道数:1;输入控制逻辑:高电平有效;工作电压:1.6V~5.5V;最大连续电流:1.5A;导通电阻:89mΩ;; LCSC Part Name: 具有受控上升时间的5.5V、1.5A、90mΩ自保护负载开关; Supplier Part: C2860814; Manufacturer: TI(德州仪器); Supplier Footprint: SC-70-6; JLCPCB Part Class: Extended Part; Datasheet: https://www.ti.com/cn/lit/ds/symlink/tps22919.pdf; Supplier: LCSC; Type: 负载开关; Number of Channels: 1; Control Input Logic: 高电平有效; Voltage - Supply: 1.6V~5.5V; Maximum Continuous Current: 1.5A; RDS(on): 89mΩ; Features: 短路保护；过流保护；输出放电功能；软启动；过温保护; Operating Temperature	-: -40℃~+105℃
U5 U6 = TPD2EUSB30DRTR: 极性:单向;反向截止电压(Vrwm):5.5V;钳位电压:8V;峰值脉冲电流(Ipp):5A@8/20us;峰值脉冲功率(Ppp):45W;击穿电压(VBR):7V;; LCSC Part Name: 单向ESD 5.5V截止 峰值脉冲电流：5A@8/20us; Supplier Part: C97502; Manufacturer: TI(德州仪器); Supplier Footprint: SOT(9x3); JLCPCB Part Class: Extended Part; Datasheet: https://www.ti.com/cn/lit/ds/symlink/tpd2eusb30.pdf; Supplier: LCSC; Polarity: 单向; Reverse Stand-Off Voltage (Vrwm): 5.5V; Clamping Voltage: 8V; Peak Pulse Current (Ipp): 5A@8/20us; Peak Pulse Power Dissipation (Ppp): 45W; Voltage - Breakdown: 7V; Number of Channels: 双路; Operating Temperature: -40℃~+85℃; level of protection: IEC 61000-4-5；IEC 61000-4-2; Type: ESD; Junction Capacitance: 0.7pF

## Nets
GND: C1.2 C2.2 C3.2 C4.2 C5.2 C6.2 C7.2 C8.2 C9.2 C10.2 C12.2 C13.2 C14.2 C15.2 C16.2 C17.2 C18.2 C19.2 C20.2 C21.2 C22.2 C23.2 C24.2 C25.1 D2.1(C) J1.17 J1.18 J1.19 J1.20 J1.A1B12(GND) J1.B1A12(GND) J2.17 Q3.2(S) R1.2 R2.2 R13.2 R14.2 R15.2 R17.2 R19.2 R21.1 R23.2 SW1.3 SW1.4 SW2.3 SW2.4 SW3.3 SW3.4 U1.1(GND) U1.2(GND) U1.15(GND) U1.33(GND) U1.55(GND) U2.5(GND) U2.11(THERMAL) U3.2(GND) U4.2(GND) U5.3(GND) U6.3(GND)
VDD_3V3: C5.1 C6.1 C7.1 C9.1 R5.1 R6.1 R7.1 R8.1 R9.1 R10.1 R11.1 R12.1 U1.28(VDD) U1.30(VDDH) U3.5(OUT) U4.1(IN)
BAT_ADC_SENSE: C25.2 R20.1 R21.2 U1.11(P0.02/AIN0)
BAT_DIV_SUPPLY: Q2.3(D) R20.2
BAT_MEAS_EN: Q3.1(G) R23.1 U1.10(P0.29/AIN5)
BAT_NTC_TBD: R19.1 U2.6(TS/MR)
BAT_PACK_TBD: C3.1 Q2.2(S) R22.1 U2.2(BAT)
BAT_SWITCH_GATE: Q2.1(G) Q3.3(D) R22.2
CHG_CE_N: R7.2 U1.22(P0.06) U2.4(CE#)
CHG_INT_N: R8.2 U1.20(P0.04/AIN2) U2.9(INT#)
CHG_PG_N: R9.2 U1.21(P0.05/AIN3) U2.3(PG#/GPO)
CHG_SCL: R6.2 U1.16(P0.27) U2.8(SCL)
CHG_SDA: R5.2 U1.19(P0.26) U2.7(SDA)
EPD_BS0: J2.8 R17.1
EPD_BUSY_TBD: J2.9 R18.2 U1.24(P0.08)
EPD_CS_N_TBD: J2.12 U1.38(P0.16)
EPD_DC_TBD: J2.11 U1.39(P0.15)
EPD_EN_TBD: R13.1 U1.27(P0.11/TRACEDATA2) U4.3(ON)
EPD_GDR: J2.2 Q1.1(G) R14.1
EPD_MOSI_TBD: J2.14 U1.37(P0.13)
EPD_PUMP: C11.2 D2.2(A) D3.1(C)
EPD_RESE: J2.3 Q1.2(S) R15.1
EPD_RESET_N_TBD: J2.10 U1.41(P0.17)
EPD_SCK_TBD: J2.13 U1.36(P0.14)
EPD_SW: C11.1 D1.2(A) L1.2 Q1.3(D)
EPD_VCOM: C22.1 J2.24
EPD_VDD: C10.1 J2.15 L1.1 R18.1 U4.5(QOD) U4.6(VOUT)
EPD_VDDL: C14.1 J2.4
EPD_VGH: J2.21 R16.2
EPD_VGL: C13.1 C21.1 D3.2(A) J2.23
EPD_VPH: C12.1 D1.1(C) R16.1
EPD_VSNH: C20.1 J2.22
EPD_VSNL1: C17.1 J2.18
EPD_VSNL2: C18.1 J2.19
EPD_VSPH: C19.1 J2.20
EPD_VSPL1: C15.1 J2.5
EPD_VSPL2: C16.1 J2.16
KEY_NEXT_N: R11.2 SW2.1 SW2.2 U1.4(P1.11)
KEY_OK_N: R12.2 SW3.1 SW3.2 U1.5(P1.12)
KEY_PREV_N: R10.2 SW1.1 SW1.2 U1.3(P1.10)
NFC1_TBD: C23.1 C24.1 U1.52(P0.09/NFC1) U1.54(P0.10/NFC2)
NRESET: U1.40(P0.18/nRESET)
SWDCLK: U1.53(SWDCLK)
SWDIO: U1.51(SWDIO)
SYS: C2.1 C4.1 U2.1(SYS) U3.1(IN) U3.3(EN)
USB_CC1: J1.A5(CC1) R1.1 U6.1(D+)
USB_CC2: J1.B5(CC2) R2.1 U6.2(D-)
USB_DM_CONN: J1.A7(DN1) J1.B7(DN2) R4.1 U5.2(D-)
USB_DM_MCU: R4.2 U1.34(D-)
USB_DP_CONN: J1.A6(DP1) J1.B6(DP2) R3.1 U5.1(D+)
USB_DP_MCU: R3.2 U1.35(D+)
USB_VBUS: C1.1 C8.1 J1.A4B9(VBUS) J1.B4A9(VBUS) U1.32(VBUS) U2.10(IN)

Not connected (* = marked no-connect by the designer): J1 A8(SBU1) B8(SBU2); J2 1* 6* 7* 25* 26*; U1 6(P1.13)* 7(P1.14)* 8(P1.15)* 9(P0.03/AIN1)* 12(P0.31/AIN7)* 13(P0.28/AIN4)* 14(P0.30/AIN)* 17(P0.00/XL1)* 18(P0.01/XL2)* 23(P0.07/TRACECLK)* 25(P1.08)* 26(P1.09/TRACEDATA3)* 29(P0.12/TRACEDATA1)* 31(DCCH)* 42(P0.19)* 43(P0.21)* 44(P0.20)* 45(P0.23)* 46(P0.22)* 47(P1.00/TRACEDATA0)* 48(P0.24)* 49(P0.25)* 50(P1.02)* 56(P1.04)* 57(P1.06)* 58(P1.07)* 59(P1.05)* 60(P1.03)* 61(P1.01)*; U3 4(NC)*; U4 4(NC)*

## Notes on the sheets
sheet 1
- 01 USB-C 与电源 — 原理图草案 / 禁止投产
- USB_VBUS → BQ25186 SYS → TPS7A0233 → VDD_3V3；电池正极与 SYS 分开。
- 302030 / 150mAh 电池候选，保护与 NTC 待确认；USB 数据/CC ESD 见第 4 页。上电前核对充电配置。
- R7 上拉 /CE 供 MCU 控制；不能代替电池保护。输入电流、有效电容、USB 浪涌仍待核算与实测。
sheet 2
- 02 主控与三个按键 — 原理图草案 / 禁止投产
- GPIO 分配为初稿；DCCH 留空，VDD/VDDH 共接 3.3 V。固件使用 LFRC，首烧需要 SWD。
- SWD：SWDIO / SWDCLK / nRESET / VDD_3V3(VTref) / GND；PCB 已有 TP1–TP5 焊盘。
- C8 4.7uF 为 VBUS 电容预算值；USB 数据/CC ESD 已加入，VBUS 保护与有效容值待核对。
- 屏幕电路见第 3 页；NFC 天线与匹配待设计。TBD 网络名保留用于追溯。
sheet 3
- 03  GDEH0154E01 / DESPI-E01 电路整合草案
- U4 断电前：先发深睡指令，再将 SPI / RESET 输出置低或高阻，避免 GPIO 反灌。
- 升压部分：器件值按 DESPI-E01；屏幕 pin 1 / 6 / 7 按型号引脚表保留 NC。
- 1uF 为 50V X7R；4.7uF 为 25V X7R；有效电容、峰值电流、BUSY 与排线方向待样品验证。
- J2: pin 1/6/7 NC；25/26 机械固定脚。
- BS0 通过 3Ω 接地；四线 SPI。
- BUSY 上拉至 EPD_VDD；极性在固件验证。
- 工程草案：未验证、不可直接下单。NTC / NFC 调谐与 USB VBUS 保护另行闭环。
sheet 4
- 04  USB ESD / 装配与调试接口
- U5 接数据线连接器侧（27Ω 前）；U6 接 CC1 / CC2。TPD2EUSB30 为 5.5V 版本。
- 就近接地，短支路；尚未完成 USB VBUS 保护、系统 ESD 验证与阻抗复核。
- PCB 已有平面焊盘（无连接器；不在采购 BOM 中）
- TP1 GND | TP2 VDD_3V3 / VTref | TP3 SWDCLK | TP4 SWDIO | TP5 NRESET
- BT+ → BAT_PACK_TBD | BT- → GND | NTC → BAT_NTC_TBD
- NTC 需热耦合电芯，型号 / B 值待确定；不得以固定电阻绕过温度检测。
- NFC1_TBD / NFC2_TBD：线圈与匹配尚未闭环；当前保留 22 × 26mm 无金属区域。
- 电池：302030 / 150mAh 候选；完整包体尺寸、保护板与允许充电电流待实物核验。
- 样品未实测；本工程未达到制造发布状态。

# Board NFC Card R1
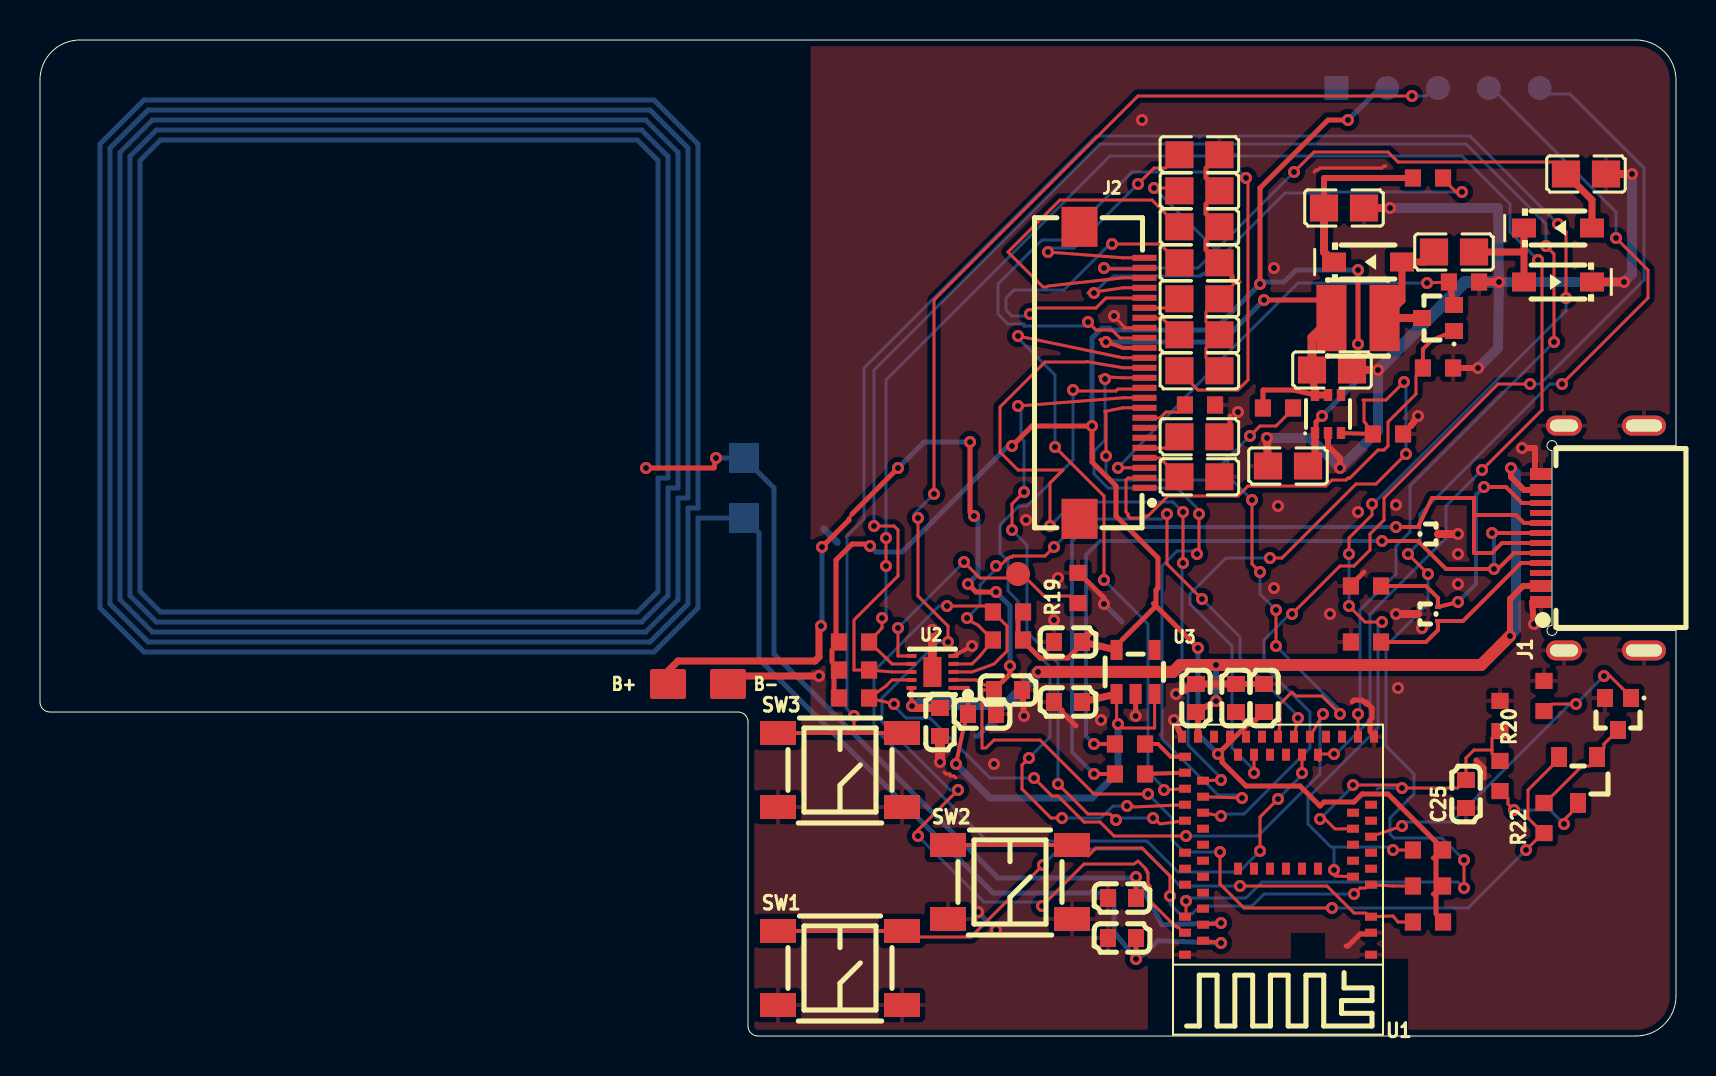
[diagram p4: board, top side]
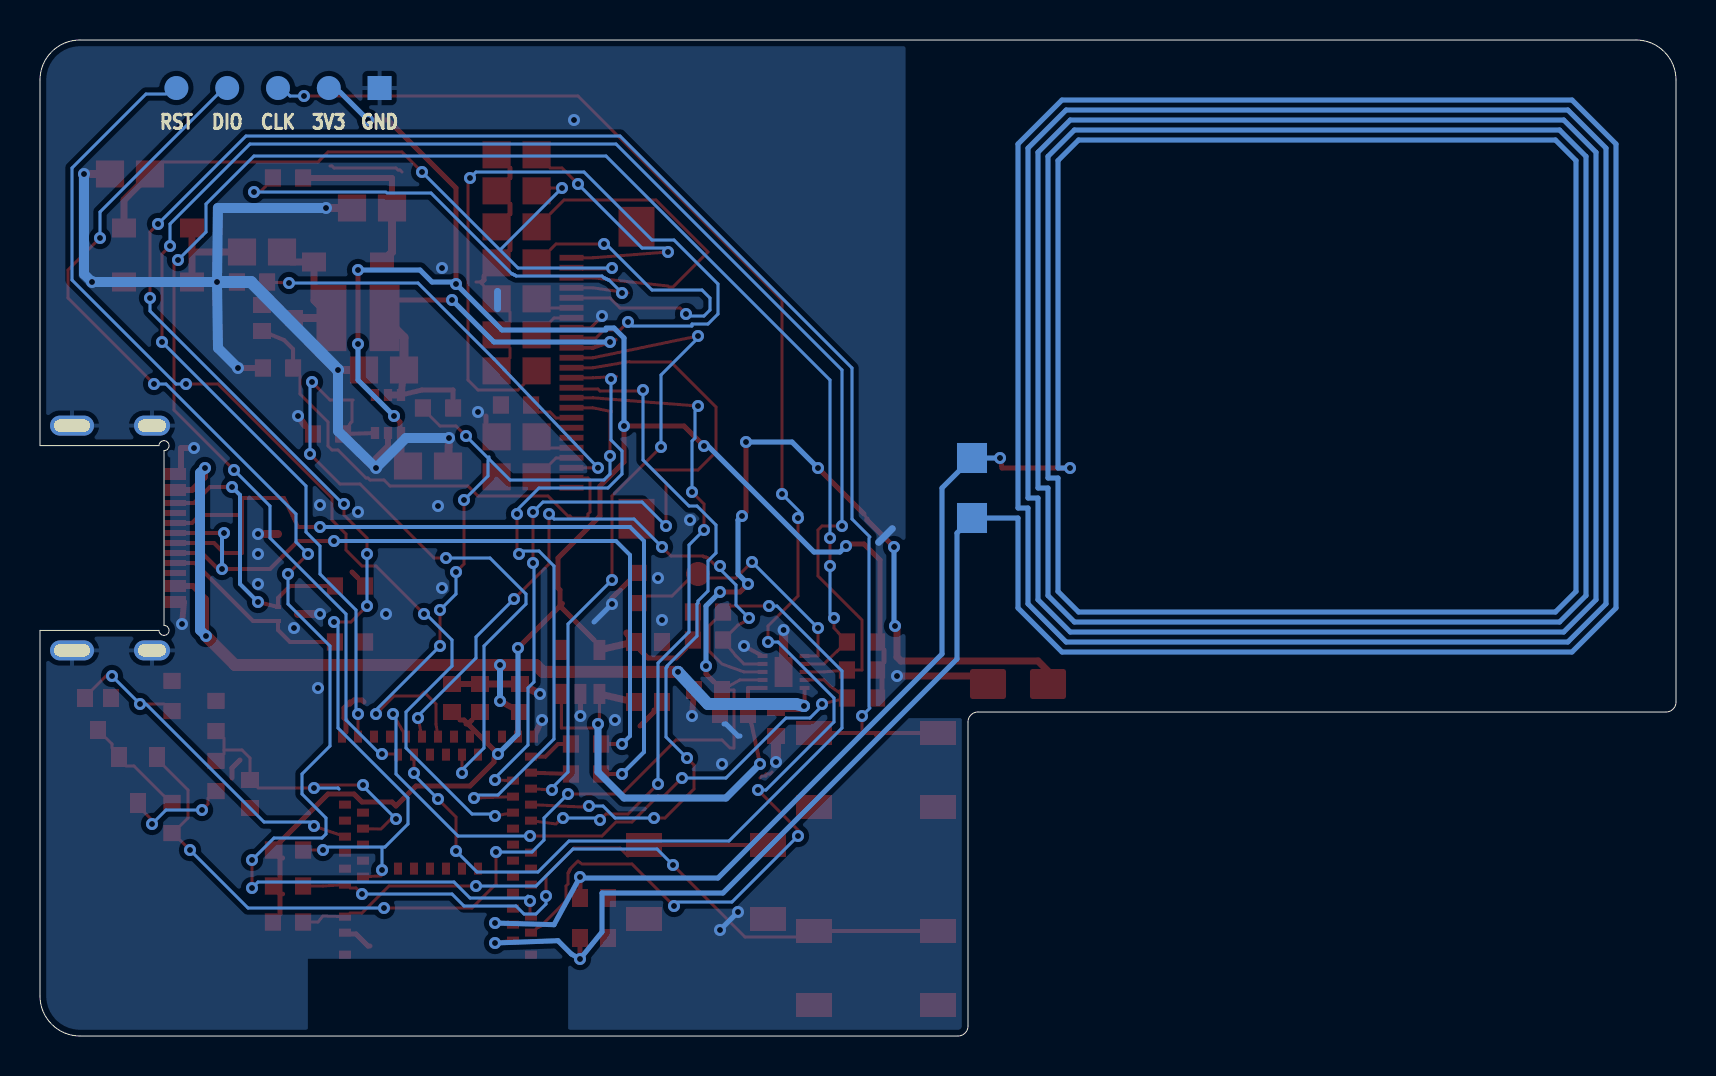
[diagram p5: board, bottom side, seen from below]

Outline 81.8 x 49.8 mm; copper layers: Top Layer, Bottom Layer. Coordinates in mm from the lower left corner of the outline.
Outline path: 0,47.8 arc(0.59,49.21) 2,49.8 79.8,49.8 arc(81.21,49.21) 81.8,47.8 81.8,29.52 75.85,29.52 arc(75.78,29.7) 75.6,29.77 arc(75.35,29.52) 75.6,29.27 75.6,20.53 arc(75.35,20.28) 75.6,20.03 arc(75.78,20.1) 75.85,20.28 81.8,20.28 81.8,2 arc(81.21,0.59) 79.8,0 35.9,0 arc(35.55,0.15) 35.4,0.5 35.4,15.7 arc(35.25,16.05) 34.9,16.2 0.5,16.2 arc(0.15,16.35) 0,16.7 0,47.8
Stack: Top Layer 0.035mm / Dielectric1 0.71mm FR4 er 4.5 / Bottom Layer 0.035mm

## Design rules (mm)
spacing copperThickness1oz (default): track to track 0.2, other pairs 0.152 to 0.3
spacing copperThickness2oz: track to track 0.203, other pairs 0.152 to 0.3
spacing copperThicknessInner0.5oz: track to track 0.089, other pairs 0.152 to 0.3
track width copperThickness1oz (default): min 0.15, default 0.2, max 2.54
track width copperThickness2oz: min 0.203, default 0.254, max 2.54
track width copperThickness0.5oz: min 0.089, default 0.254, max 2.54
differential pair differentialPair (default): width min 0.127, default 0.254, max 2.54; gap min 0.152, default 0.152

## Placement (name value [footprint] x y rotation side)
C1  2.2uF  [C0603]  57.8 16.9 90 top
C2  10uF  [C0603]  47.1 16.1 0 top
C3  2.2uF  [C0603]  48.4 17.3 0 top
C4  2.2uF  [C0603]  51.4 16.7 180 top
C5  2.2uF  [C0603]  51.4 19.7 180 top
C6  10uF  [C0603]  61.2 16.9 90 top
C7  100nF  [C0603]  59.8 16.9 90 top
C8  4.7uF  [C0603]  45 15.7 270 top
C9  1uF  [C0805]  62.4 28.5 180 top
C10  1uF  [C0805]  64.6 33.3 0 top
C11  1uF  [C0805]  70.7 39.2 0 top
C12  1uF  [C0805]  65.2 41.4 0 top
C13  1uF  [C0805]  77.3 43.1 0 top
C14  4.7uF  [C0805]  57.97 27.96 0 top
C15  4.7uF  [C0805]  57.97 29.96 0 top
C16  1uF  [C0805]  57.97 33.26 0 top
C17  1uF  [C0805]  57.97 35.06 0 top
C18  1uF  [C0805]  57.97 36.86 0 top
C19  4.7uF  [C0805]  57.97 38.66 0 top
C20  1uF  [C0805]  57.97 40.46 0 top
C21  1uF  [C0805]  57.97 42.26 0 top
C22  1uF  [C0805]  57.97 44.06 0 top
C23  220pF  [C0603]  54.1 6.9 180 top
C24  220pF  [C0603]  54.1 4.9 180 top
C25  100nF  [C0603]  71.3 12.1 90 top
D1  MBR0530T1G  [SOD-123_L2.7-W1.6-LS3.7-RD-1]  66.4 38.7 0 top
D2  MBR0530T1G  [SOD-123_L2.7-W1.6-LS3.7-RD-1]  75.9 37.7 180 top
D3  MBR0530T1G  [SOD-123_L2.7-W1.6-LS3.7-RD-1]  75.9 40.4 0 top
J1  USB4500-03-0-A  [USB-SMD_USB4500-03-0-A]  77.62 24.9 90 top
J2  FPC-05FB-24PH20  [FPC-SMD_24P-P0.50_FPC-05FB-24PH20]  53.6 33.16 270 top
L1  47uH  [IND-SMD_L3.0-W3.0]  65.9 35.9 180 top
NOREF  -  [Pad_e105]  74.98 47.4 0 top
NOREF#2  -  [Pad_e104]  72.44 47.4 0 top
NOREF#3  -  [Pad_e103]  69.9 47.4 0 top
NOREF#4  -  [Pad_e246]  35.2 28.9 0 top
NOREF#5  -  [Pad_e106]  31.4 17.6 0 top
NOREF#6  -  [Pad_e102]  67.36 47.4 0 top
NOREF#7  -  [Pad_e245]  35.2 25.9 0 top
NOREF#8  -  [Pad_e107]  34.4 17.6 0 top
NOREF#9  -  [Pad_e101]  64.82 47.4 0 top
NOREF#10  -  [Pad_e108]  48.9 23.1 0 top
Q1  SI1308EDL-T1-GE3  [SOT-323_L2.0-W1.3-P1.30-LS2.1-BR]  69.9 35.9 0 top
Q2  AO3401A  [SOT-23_L2.9-W1.3-P1.90-LS2.4-BR]  76.9 12.8 90 top
Q3  SI1308EDL  [SOT-323_L2.0-W1.3-P1.30-LS2.1-BR]  78.9 16.1 90 top
R1  5.1kΩ  [R0603]  66.3 19.7 180 top
R2  5.1kΩ  [R0603]  66.3 22.5 180 top
R3  0Ω  [R0603]  54.5 13.1 0 top
R4  0Ω  [R0603]  54.5 14.6 0 top
R5  10kΩ  [R0603]  40.7 19.7 0 top
R6  10kΩ  [R0603]  40.7 18.3 0 top
R7  10kΩ  [R0603]  48.4 19.8 180 top
R8  10kΩ  [R0603]  40.7 16.9 0 top
R9  10kΩ  [R0603]  48.4 21.2 180 top
R10  10kΩ  [R0603]  69.4 5.7 180 top
R11  10kΩ  [R0603]  69.4 7.5 180 top
R12  10kΩ  [R0603]  69.4 9.3 180 top
R13  100kΩ  [R0603]  67.4 30.1 0 top
R14  10kΩ  [R0603]  69.9 33.4 0 top
R15  2.2Ω  [R0603]  71.2 37.7 0 top
R16  0Ω  [R0603]  69.4 42.9 0 top
R17  3Ω  [R0603]  58 31.55 0 top
R18  10kΩ  [R0603]  61.9 31.4 0 top
R19  10kΩ  [R0603]  51.9 22.4 90 top
R20  1MΩ  [R0603]  73 13 270 top
R21  1MΩ  [R0603]  73 16 270 top
R22  1MΩ  [R0603]  75.2 10.9 90 top
R23  1MΩ  [R0603]  75.2 17 90 top
SW1  SKQGABE010  [KEY-SMD_4P-L5.2-W5.2-P3.70-LS6.4]  40 3.4 0 top
SW2  SKQGABE010  [KEY-SMD_4P-L5.2-W5.2-P3.70-LS6.4]  48.5 7.7 0 top
SW3  SKQGABE010  [KEY-SMD_4P-L5.2-W5.2-P3.70-LS6.4]  40 13.3 0 top
U1  MDBT50Q-P1MV2  [COMM-SMD_MDBT50Q-1MV2]  61.9 9.52 180 top
U2  BQ25186DLHR  [WSON-10_L2.2-W2.0-P0.40-BL-EP_TI_DLH0010A]  44.62 18.2 90 top
U3  TPS7A0233DBVR  [SOT-23-5_L2.9-W1.6-P0.95-LS2.8-BL]  54.78 18.2 0 top
U4  TPS22919DCKT  [SC-70-6_L2.0-W1.3-P0.65-LS2.1-BR]  64.4 31.1 270 top
U5  TPD2EUSB30DRTR  [SOT-9X3-3_L1.0-W0.8-P0.35-LS1.0-BR]  69.4 25.1 180 top
U6  TPD2EUSB30DRTR  [SOT-9X3-3_L1.0-W0.8-P0.35-LS1.0-BR]  69.4 21.1 0 top

## Footprints (pads in the part's own frame, mm; a bottom-side part is the same pattern mirrored in y, then rotated)
C0603
  rect 0.8x0.9 smd: 1(-0.7,0) 2(0.7,0)
C0805
  rect 1.41x1.35 smd: 1(-1,0) 2(1,0)
COMM-SMD_MDBT50Q-1MV2
  rect 0.6x0.4 smd: 1(-4.65,5.45) 2(-4.65,4.35) 3(-4.65,3.55) 4(-4.65,1.95) 5(-3.75,1.55) 6(-4.65,1.15) 7(-3.75,0.75) 8(-4.65,0.35) 9(-3.75,-0.05) 10(-4.65,-0.45) 11(-3.75,-0.85) 12(-4.65,-1.25) 13(-3.75,-1.65) 14(-4.65,-2.05) 34(4.65,-4.45) 35(4.65,-3.65) 36(3.75,-3.25) 37(4.65,-2.85) 38(3.75,-2.45) 39(4.65,-2.05) 40(3.75,-1.65) 41(4.65,-1.25) 42(3.75,-0.85) 43(3.75,-0.05) 44(4.65,0.35) 45(3.75,0.75) 46(4.65,1.15) 47(3.75,1.55) 48(4.65,1.95) 49(3.75,2.35) 50(3.75,3.15) 51(4.65,3.55) 52(3.75,3.95) 53(4.65,4.35) 54(3.75,4.75) 55(4.65,5.45)
  rect 0.4x0.6 smd: 15(-4.8,-5.45) 16(-4,-5.45) 17(-3.2,-5.45) 18(-2.4,-5.45) 19(-2,-4.55) 20(-1.6,-5.45) 21(-1.2,-4.55) 22(-0.8,-5.45) 23(-0.4,-4.55) 24(0,-5.45) 25(0.4,-4.55) 26(0.8,-5.45) 27(1.2,-4.55) 28(1.6,-5.45) 29(2,-4.55) 30(2.4,-5.45) 31(3.2,-5.45) 32(4,-5.45) 33(4.8,-5.45) 56(-2,1.15) 57(-1.2,1.15) 58(-0.4,1.15) 59(0.4,1.15) 60(1.2,1.15) 61(2,1.15)
FPC-SMD_24P-P0.50_FPC-05FB-24PH20
  rect 0.3x1.2 smd: 1(5.75,1.625) 2(5.25,1.625) 3(4.75,1.625) 4(4.25,1.625) 5(3.75,1.625) 6(3.25,1.625) 7(2.75,1.625) 8(2.25,1.625) 9(1.75,1.625) 10(1.25,1.625) 11(0.75,1.625) 12(0.25,1.625) 13(-0.25,1.625) 14(-0.75,1.625) 15(-1.25,1.625) 16(-1.75,1.625) 17(-2.25,1.625) 18(-2.75,1.625) 19(-3.25,1.625) 20(-3.75,1.625) 21(-4.25,1.625) 22(-4.75,1.625) 23(-5.25,1.625) 24(-5.75,1.625)
  rect 2x1.8 smd: 25(-7.3,-1.625) 26(7.3,-1.625)
IND-SMD_L3.0-W3.0
  rect 1.5x3.32 smd: 1(1.328,0) 2(-1.328,0)
KEY-SMD_4P-L5.2-W5.2-P3.70-LS6.4
  rect 1.8x1.2 smd: 1(-3.1,1.85) 2(3.1,1.85) 3(-3.1,-1.85) 4(3.1,-1.85)
Pad_e101
  rect 1.199x1.199 smd far side: TP1(0,0)
Pad_e102
  round 1.199 smd far side: TP2(0,0)
Pad_e103
  round 1.199 smd far side: TP3(0,0)
Pad_e104
  round 1.199 smd far side: TP4(0,0)
Pad_e105
  round 1.199 smd far side: TP5(0,0)
Pad_e106
  rrect 1.801x1.501 smd: BP(0,0)
Pad_e107
  rrect 1.801x1.501 smd: BN(0,0)
Pad_e108
  round 1.199 smd: NTC(0,0)
Pad_e245
  rect 1.501x1.501 smd far side: NFC1(0,0)
Pad_e246
  rect 1.501x1.501 smd far side: NFC2(0,0)
R0603
  rect 0.806x0.864 smd: 1(-0.753,0) 2(0.753,0)
SC-70-6_L2.0-W1.3-P0.65-LS2.1-BR
  rect 0.6x0.42 smd: 1(0.95,-0.65) 2(0.95,0) 3(0.95,0.65) 4(-0.95,0.65) 5(-0.95,0) 6(-0.95,-0.65)
SOD-123_L2.7-W1.6-LS3.7-RD-1
  rect 1.2x0.95 smd: 1(-1.7,0) 2(1.7,0)
SOT-9X3-3_L1.0-W0.8-P0.35-LS1.0-BR
  rect 0.3x0.2 smd: 1(0.5,-0.35) 2(0.5,0.35) 3(-0.5,0)
SOT-23-5_L2.9-W1.6-P0.95-LS2.8-BL
  rect 0.6x1 smd: 1(-0.95,-1.1) 2(0,-1.1) 3(0.95,-1.1) 4(0.95,1.1) 5(-0.95,1.1)
SOT-23_L2.9-W1.3-P1.90-LS2.4-BR
  rect 1x0.8 smd: 1(1.15,-0.95) 2(1.15,0.95) 3(-1.15,0)
SOT-323_L2.0-W1.3-P1.30-LS2.1-BR
  rect 0.9x0.8 smd: 1(0.8,-0.65) 2(0.8,0.65) 3(-0.8,0)
USB-SMD_USB4500-03-0-A
  oval 1x1.8 hole 0.6x1.4: 17(-5.62,1.425) 18(5.62,1.425)
  oval 1x2.2 hole 0.6x1.8: 19(-5.62,-2.575) 20(5.62,-2.575)
  rect 0.6x1.1 smd: A1B12(-3.2,2.575) A4B9(-2.4,2.575) B1A12(3.2,2.575) B4A9(2.4,2.575)
  rect 0.3x1.1 smd: A5(-1.25,2.575) A6(-0.25,2.575) A7(0.25,2.575) A8(1.25,2.575) B5(1.75,2.575) B6(0.75,2.575) B7(-0.75,2.575) B8(-1.75,2.575)
WSON-10_L2.2-W2.0-P0.40-BL-EP_TI_DLH0010A
  rect 0.2x0.5 smd: 1(-0.8,-1.05) 2(-0.4,-1.05) 3(0,-1.05) 4(0.4,-1.05) 5(0.8,-1.05) 6(0.8,1.05) 7(0.4,1.05) 8(0,1.05) 9(-0.4,1.05) 10(-0.8,1.05)
  rect 1.501x0.899 smd: 11(0,0)

## Nets
As in the schematic, except:
GND: C1.2 C2.2 C3.2 C4.2 C5.2 C6.2 C7.2 C8.2 C9.2 C10.2 C12.2 C13.2 C14.2 C15.2 C16.2 C17.2 C18.2 C19.2 C20.2 C21.2 C22.2 C23.2 C24.2 C25.1 D2.1 J1.17 J1.18 J1.19 J1.20 J1.A1B12 J1.B1A12 J2.17 NOREF#8.BN NOREF#9.TP1 Q3.2 R1.2 R2.2 R13.2 R14.2 R15.2 R17.2 R19.2 R21.1 R23.2 SW1.3 SW1.4 SW2.3 SW2.4 SW3.3 SW3.4 U1.1 U1.2 U1.15 U1.33 U1.55 U2.5 U2.11 U3.2 U4.2 U5.3 U6.3
VDD_3V3: C5.1 C6.1 C7.1 C9.1 NOREF#6.TP2 R5.1 R6.1 R7.1 R8.1 R9.1 R10.1 R11.1 R12.1 U1.28 U1.30 U3.5 U4.1
BAT_NTC_TBD: NOREF#10.NTC R19.1 U2.6
BAT_PACK_TBD: C3.1 NOREF#5.BP Q2.2 R22.1 U2.2
NFC1_TBD: C23.1 C24.1 NOREF#4.NFC2 NOREF#7.NFC1 U1.52 U1.54
NRESET: NOREF.TP5 U1.40
SWDCLK: NOREF#3.TP3 U1.53
SWDIO: NOREF#2.TP4 U1.51

Pads without a net: J1 A8 B8; J2 1 6 7 25 26; U1 6 7 8 9 12 13 14 17 18 23 25 26 29 31 42 43 44 45 46 47 48 49 50 56 57 58 59 60 61; U3 4; U4 4

## Via types
v1: diameter 0.6, hole 0.299, Top Layer to Bottom Layer, 46 vias
v2: diameter 0.6, hole 0.3, Top Layer to Bottom Layer, 150 vias
v3: diameter 0.6, hole 0.305, Top Layer to Bottom Layer, 1 via
v4: diameter 0.6, hole 0.302, Top Layer to Bottom Layer, 1 via

## Routing (per net, layer and track width the routed paths; a pad name or vN(x,y) marks a point on that pad's centre or on a via; arc(x,y) is an arc through that point)
GND: length 101.5
  Top Layer w0.15: 59.6,37.5 59.8,37.7 60,37.7 ; 63.7,43.2 63.8,43.3 63.9,43.3 64,43.4 67.1,43.4 67.2,43.5 67.3,43.5 ; 45.2,13.2 45.3,13.1 45.5,13.1 45.5,13 45.7,13 45.8,12.9 ; J2.17 54.25,35.41 v2(53.7,36) ; 58.3,34.4 58.3,33.9 ; 58.3,36.2 58.3,35.7
  Top Layer w0.2: 45.67,19 v1(46.6,19.5)
  Top Layer w0.25: 65.6,16.7 65.7,16.8 66.1,16.8 66.2,16.7 66.3,16.7 66.3,16.6 66.4,16.6 66.6,16.4 66.6,15.9 66.5,15.8 66.5,15.2 ; 51.8,15.5 51.1,16.2 51.1,16.3 ; U3.2 v2(54.78,16) ; 72.2,12.9 72.2,13.4 71.8,13.8 ; 58.3,41.6 58.3,41.1 ; 52.3,22.8 53.2,21.9 v2(53.2,21.6) ; 59.5,31 59.5,30.6 ; 65.3,4.5 65.4,4.5 66,5.1 66.3,5.1 ; 59.7,37.7 59.6,37.8 59.6,38 ; 58.3,39.8 58.3,39.3 ; 58.3,43.4 58.3,42.9 ; 65.9,22.9 66.2,23.2
  Top Layer w0.3: U4.2 64.4,29.5 65,28.9 v1(65,28.4) ; v1(74.1,29.4) 74.75,29.4 74.75,28.1 J1.B1A12 ; 57.1,14.97 v2(56.7,15.8) ; C7.2 C6.2 ; 70.65,33.4 v1(71.9,33.4) ; v1(74.7,20.6) 74.6,21.7 J1.A1B12 ; C3.2 v1(49.2,16)
  Top Layer w0.35: v1(38.95,18) 34.8,18 NOREF#8.BN ; C1.2 C7.2 ; v2(68.9,31) 68.56,30.53
  Top Layer w0.4: U5.3 v1(70.9,25.1) ; C1.2 v1(56.8,17.1) ; C12.2 v1(67.5,41.4) ; C13.2 v1(79.6,43.1) ; U6.3 v1(67.8,21.1) ; C9.2 v1(61.35,29.9) ; 71.95,37.7 v1(72.95,37.7) ; C10.2 v1(66.9,33.3) ; D2.1 v1(79.2,37.7)
  Top Layer w0.45: U2.11 v1(44.62,20.3)
  Top Layer w0.5: C8.2 v1(45,13.7)
  Bottom Layer w0.25: 54.1,20.7 v2(53.2,21.6) ; v2(47.8,5.3) v2(46.9,6.2) ; 46.8,15 46.9,15 47.5,15.6 47.6,15.6
  Bottom Layer w0.35: 58.92,36.37 58.92,37.23 ; 39.87,24.68 39.18,25.37
  Bottom Layer w0.5: v1(61.35,29.9) 63.5,29.9 v1(65,28.4) 66.9,30.25 v1(66.9,33.3) ; v1(72.95,37.7) 72.9,34.4 v1(71.9,33.4) ; v1(72.95,37.7) 72.9,41.4 v1(67.5,41.4) ; v1(72.95,37.7) v1(79.2,37.7) 79.6,38.1 v1(79.6,43.1)
  Bottom Layer w0.6: v1(72.95,37.7) 71.25,37.7 v1(66.9,33.3)
  vias: v1(50.9,22.9) v1(53.05,15.8) v1(61.9,26.5) v1(64.5,21.1) v1(67.8,26.55) v1(67.9,17.4) v1(70.9,24.1) v2(47.7,13.6) v2(49.3,25.8) v2(50.7,20.8) v2(55.1,45.8) v2(59.9,31.2) v2(61.7,38.4) v2(61.7,22.4) v2(65.9,26.2) v2(69.1,20.4) v2(70.9,22.6)
VDD_3V3: length 108.9
  Top Layer w0.25: 59.1,13.9 59.1,13.7 60.3,12.5 63,12.5 64,11.5 64.2,11.7 65.7,11.7 66.1,12.1 67.4,12.1 69.8,9.7 69.8,8.9 ; 60.4,15.6 60.6,15.8 60.8,15.8 ; 60.4,15.6 60.2,15.8 ; 60.4,15.6 60.5,15.6 ; 60.4,15.6 v2(58.9,14.1) ; v2(52.6,30.5) 52.6,28.7 53.8,27.5 53.8,26 55.9,23.9 55.9,22.4 55.8,22.3 55.8,21.5 ; v2(61,37.6) 61,42.4 64.4,45.8 v2(65.4,45.8) ; 39.6,19.3 39.6,18.7 ; 55.67,21.63 55.8,21.5 ; 55.8,21.5 v2(57.9,19.4) ; 55.8,21.5 54.1,19.8 ; 39.8,20.1 39.8,23.8 40.6,24.6 41.4,24.6 ; 63.8,30.4 63.8,30.7 v2(64.1,31) ; v2(65.9,38.3) v2(65.9,34.6) ; 48.9,20.2 48.9,20.8 ; 39.7,17.9 39.7,17.3 ; 69.8,8.9 69.8,7.1 ; 69.8,8.9 69.67,8.9 ; 69.8,7.1 69.8,6.1 ; 69.8,7.1 69.67,7.1 ; v2(48.6,29.5) 49.6,30.5 52.3,30.5 ; 49.5,19.4 50,18.9 51.4,18.9 51.8,19.3
  Top Layer w0.35: 63.75,28.85 63.75,30.15 ; U3.5 C5.1 52.46,20.15
  Bottom Layer w0.25: v2(65.9,38.3) 62.8,38.3 62.2,37.7 61.2,37.7 ; 48.4,29.5 43.1,24.2 41.8,24.2 v2(41.5,24.5) ; 53.5,35.3 58.7,35.3 v2(61,37.6) ; v2(58.9,14.1) 57.9,15.1 v2(57.9,19.4) ; v2(64.1,31) 65.9,32.8 v2(65.9,34.6) ; v2(65.4,45.8) 66.8,47.2 ; v2(52.6,30.5) 52.6,34.9 53.1,35.4 53.5,35.4
BAT_ADC_SENSE: length 13.2
  Top Layer w0.15: 71.3,13.1 71.3,13.9 71.7,14.3 72.6,14.3 ; 72.6,14.1 72.6,14.3 ; 72.6,14.3 72.6,14.9 ; 67.85,12.55 v2(65.65,12.55) ; 64.25,10.85 64.7,10.4 ; U1.11 64.75,10.35 ; 70.9,12.4 v2(68.1,12.4)
  Bottom Layer w0.15: v2(68.1,12.4) 66.9,12.4 66.85,12.35 ; 65.65,12.5 v2(64,10.85)
BAT_DIV_SUPPLY: length 4.1
  Top Layer w0.15: 76.2,10.8 76.6,11.2 ; 73.4,11.9 73.4,11.6 v2(73.7,11.3)
  Bottom Layer w0.15: v2(76.2,10.6) 75.5,11.3 v2(73.7,11.3)
BAT_MEAS_EN: length 16.8
  Top Layer w0.15: 75.6,16.6 v2(76.8,16.6) ; v2(78.2,18) 78.5,18 79.2,17.3 ; 66.55,9.97 v1(68.1,10.5)
  Bottom Layer w0.15: 68.3,10.7 70.6,10.7 76.5,16.6 ; v2(76.8,16.6) v2(78.2,18)
BAT_NTC_TBD: length 11.4
  Top Layer w0.15: v2(46.2,23.7) 47,22.9 48.4,22.9 ; 43.57,19 42.9,19 v1(42.9,20.4) ; 49.4,22.8 50.2,22 51.5,22
  Bottom Layer w0.15: v2(46.2,23.7) 43.1,20.6
BAT_PACK_TBD: length 80.2
  Top Layer w0.15: 75.6,13.5 74.4,12.3 74.4,10.9 74.8,10.5 ; v2(64.6,6.4) 60.2,6.4 59,7.6 v2(59,9.2) ; v2(74.3,9.3) 74.8,9.8 ; v2(55.4,12.1) 52.7,12.1 50,14.8 47.7,14.8 47.3,14.4 ; 40.51,25.96 40.53,26 ; 45.67,17.81 46.8,17.81 C3.1 47.1,17.3 47.1,14.39 ; 47.18,14.4 47.22,14.4
  Top Layer w0.25: v2(39.1,24.45) 40.45,25.8 40.45,25.85 ; v2(48.5,18.5) 48.5,18.1 48.1,17.7 ; v2(46.7,26) 46.5,26.2 v2(46.5,29.7) ; v2(46.4,22.6) 46.8,22.2 v2(47.8,22.2) ; v2(42.9,28.4) 40.6,26.1
  Top Layer w0.35: 38.95,20.4 38.95,18.95 38.75,18.75 31.9,18.75 31.4,18.25
  Bottom Layer w0.15: v2(64.6,6.4) 71.4,6.4 v2(74.3,9.3) ; v2(59,9.2) 57.2,9.2 56.6,9.8 56.6,10.9 v2(55.4,12.1)
  Bottom Layer w0.25: v2(46.7,26) 46.9,25.8 46.9,23.1 v2(46.4,22.6) ; v2(42.9,28.4) 44.2,29.7 v2(46.5,29.7) ; v2(47.8,22.2) 48.5,21.5 v2(48.5,18.5) ; 39.1,24.6 39.1,20.6
  vias: v2(39.05,20.5)
BAT_SWITCH_GATE: length 3.1
  Top Layer w0.15: 75.6,12 77.1,13.5 77.5,13.5 ; 78.5,14.9 78.2,14.6 78.2,14.4
CHG_CE_N: length 30.4
  Top Layer w0.15: 48,23.5 48.4,23.9 48.45,23.9 48.5,23.95 48.6,23.95 48.65,24 50.25,24 v2(50.7,24.45) ; 45.67,18.6 46.6,18.6 47,19 47.65,19.8 46.9,20.54 46.2,20.9 ; v2(56.35,26.1) 56.35,23.6 v2(58.1,21.85) ; U1.22 v1(62.9,15.9)
  Bottom Layer w0.15: v2(56.35,26.1) 56.1,25.85 52.1,25.85 v2(50.7,24.45) ; v2(58.1,21.85) 60,19.95 60,18.9 62.75,16.15 ; v2(46.35,20.9) 47,21.55 47,22.55 47.8,23.35
  vias: v2(47.8,23.5)
CHG_INT_N: length 32.8
  Top Layer w0.15: v2(57.3,10) 53.7,10 53,10.7 52.2,10.7 50.9,12 50.6,12 v2(49.7,12.9) ; 43.57,17.81 42.6,17.81 42.3,17.5 41.45,16.9 v1(42.7,16.6) ; U1.20 v1(64.15,16.1)
  Bottom Layer w0.15: 64,15.85 64,13.1 60.9,10 v2(57.3,10) ; 42.85,16.35 43.3,15.9 44.5,15.9 47.5,12.9 v2(49.7,12.9)
CHG_PG_N: length 42.4
  Top Layer w0.15: v2(61,9.25) 61,10.95 v2(61.9,11.85) ; 47.25,21.5 v2(45.35,21.5) ; 47.85,18.75 47.75,18.65 ; 47.9,18.8 48.35,19.25 48.35,20.5 48.05,20.8 ; U1.21 v1(63.1,13.15) ; 45.67,18.2 46.6,18.2 47.7,18.6
  Bottom Layer w0.15: v2(61,9.25) 59.95,8.2 56.9,8.2 55.35,9.75 47.35,9.75 41.7,15.4 41.7,18.25 44.95,21.5 v2(45.35,21.5) ; v2(61.9,11.85) 62.95,12.9
CHG_SCL: length 89.2
  Top Layer w0.15: 43.57,18.2 42.6,18.2 41.45,18.3 40.7,18.3 40.7,20.8 ; U1.16 v1(65.9,16.1) ; v2(41.7,25.5) 42.7,25.5 42.9,25.3 42.9,23 41.1,21.2 ; v2(75.3,39.5) 75.7,39.1 v2(75.7,34.7) ; 41.05,21.15 40.95,21.05 ; 40.75,20.85 40.9,21
  Bottom Layer w0.15: v2(75.7,34.7) 68.5,27.5 68.5,25.2 67.8,24.5 67.8,23.1 66,21.3 66,16.3 ; v2(41.7,25.5) 41.7,33.3 53,44.6 71.3,44.6 75.3,40.6 v2(75.3,39.5)
CHG_SDA: length 85.6
  Top Layer w0.15: v2(72.1,28.3) 75.1,31.3 75.1,38.6 ; U1.19 63.96,13.77 ; v1(42.1,20.9) 42.1,20.4 41.45,19.7 42.3,18.9 42.6,18.6 43.57,18.6 ; v2(64.7,14.1) 64.1,14.1 ; v2(42.3,23.5) v2(42.3,24.9)
  Bottom Layer w0.15: 64.8,14.1 66.5,15.8 66.5,21.1 70.3,24.9 70.3,26.5 v2(72.1,28.3) ; v2(74.9,38.8) 73.5,40.2 73.5,41.6 71.1,44 53.5,44 42.3,32.8 v2(42.3,24.9) ; 42.3,21.1 v2(42.3,23.5)
EPD_BS0: length 1.2
  Top Layer w0.15: 56.9,31.2 56.3,31.2 56,30.9 55.8,30.9
EPD_BUSY_TBD: length 35.7
  Top Layer w0.15: 53.3,31.2 v2(53.3,29) ; v2(60.5,30) 61,30.5 61.8,30.5 62.3,31 ; v2(65,16.1) 64.1,17 62.8,17 ; v2(61.8,21.3) v2(61.8,19.5) ; J2.9 54.15,31.41 53.23,31.22 ; 61.9,14.97 62,15.6 62,16.6 62.6,17.2 ; v2(60.6,26.8) 60.6,23.6 v2(61,23.2) ; 62.75,17.05 62.65,17.15
  Bottom Layer w0.15: v2(61,23.2) 61,22.1 v2(61.8,21.3) ; v2(61.8,19.5) 65,16.3 ; v2(53.3,29) 53.3,28.1 53.6,27.8 58.3,27.8 v2(60.5,30) ; 59.35,28.85 59.35,28.96 ; 59.4,28.8 59.4,28 v2(60.6,26.8)
EPD_CS_N_TBD: length 32.5
  Top Layer w0.15: J2.12 54.15,32.91 52.98,32.98 ; v2(57.95,26.1) 57.95,24.2 ; 58.15,11.97 v1(60.1,11.9)
  Bottom Layer w0.15: 57.7,24.25 56.85,24.25 56.1,23.5 56.1,14.85 58.9,12.05 59.85,12.05 ; v2(53.25,32.85) 53.25,29.8 52.7,29.25 52.7,28.1 53.4,27.4 56.85,27.4 57.95,26.3
  vias: v2(57.85,24.1)
EPD_DC_TBD: length 35.3
  Top Layer w0.15: 57.25,11.57 54.7,11.45 ; v2(49.45,13.9) 49.1,13.55 49.1,12.35 50.55,10.9 v2(51.1,10.9) ; 51.7,32.25 53.8,32.25 53.9,32.35 54.65,32.35 ; v2(54.35,11.5) 54.65,11.5
  Bottom Layer w0.15: v2(49.45,13.9) 50.5,14.95 50.5,18.4 50.45,18.45 50.45,18.5 48.95,20 48.95,21.6 48.9,21.65 48.9,21.75 48.4,22.25 48.4,23.75 48,24.15 48,25.55 48.95,26.5 49.35,26.5 51.65,28.8 v2(51.65,32.3) ; v2(54.35,11.5) 53.65,11.5 53.05,10.9 v2(51.1,10.9)
EPD_EN_TBD: length 33.9
  Top Layer w0.15: v2(68.2,32.7) 67.3,31.8 66.14,31.8 ; v2(68.3,29.1) 66.8,27.6 65.8,27.6 62.1,23.9 v2(61.5,23.9) ; 66.65,30.1 66.3,30.6 66.27,30.67 ; 66.2,31.75 66.2,30.7 ; 60.7,14.07 v1(60.7,13.15)
  Top Layer w0.2: 65.05,30.15 66.65,30.1
  Bottom Layer w0.15: 68.3,32.6 v2(68.3,29.1) ; 60.6,13.4 59.6,14.4 59.6,19.5 57.5,21.6 57.5,22.1 59.3,23.9 v2(61.5,23.9)
EPD_GDR: length 23.7
  Top Layer w0.15: 54.7,27.9 54.4,27.9 54.3,27.8 54.3,26.2 54.4,26.1 54.4,26 54.5,25.9 55.2,25.9 55.3,26 55.4,26 56.4,27 59.9,27 60.4,27.5 64.3,27.5 64.6,27.8 65.3,27.8 65.4,27.9 65.5,27.9 66.9,29.3 67.2,29.3 67.4,29.5 67.4,30.7 68.8,32.1 68.8,33
  Top Layer w0.2: Q1.1 69.6,34.8 69.15,34.35 R14.1
EPD_MOSI_TBD: length 32.6
  Top Layer w0.15: v1(48.9,35) 54.15,33.91 55.22,33.91 ; 57.25,12.37 v1(56.2,12.3) ; v2(50.75,29.45) 53.2,27 v2(53.2,22.8)
  Bottom Layer w0.15: 56.05,12.55 55.4,13.2 55.4,20.6 v2(53.2,22.8) ; 49.05,34.75 50.75,33.05 v2(50.75,29.45)
EPD_PUMP: length 5.2
  Top Layer w0.35: 74.2,39.2 D3.1 ; 74.2,39.2 C11.2 ; 74.2,39.2 D2.2
EPD_RESE: length 23
  Top Layer w0.15: R15.1 v2(69.35,37.65) ; v2(53.9,28.41) J2.3
  Top Layer w0.3: Q1.2 R15.1
  Bottom Layer w0.15: v2(53.9,28.41) 59.1,33.85 62.9,37.65 v2(69.35,37.65)
EPD_RESET_N_TBD: length 33.3
  Top Layer w0.15: v2(48.6,25.3) 48.6,26.6 v2(49.2,27.2) ; J2.10 54.15,31.91 v1(48.9,31.5) ; 57.25,10.77 56,10.6 ; v2(53.8,10.8) 53.5,11.1 52.4,11.1 v2(50.9,12.6) ; 55.7,10.9 55.95,10.65
  Bottom Layer w0.15: v2(50.9,12.6) 50.9,18.65 49.35,20.2 49.35,24.55 v2(48.6,25.3) ; 53.9,10.9 v2(55.65,10.9) ; 49.05,31.25 49.05,29.9 49.2,29.75 v2(49.2,27.2)
EPD_SCK_TBD: length 39.1
  Top Layer w0.15: v2(57.15,26.2) v2(57.15,23.65) ; 52.33,33.72 54.15,33.41 55.22,33.41 ; 58.15,12.77 v1(59.05,12.8) ; 52.3,33.7 50.25,33.7 48,31.45 48,29.2 48.9,28.3 51.15,28.3 50.5,27.65 v2(50.5,25.5)
  Bottom Layer w0.15: 58.9,13.05 57.4,14.55 57.4,17.4 57.1,17.7 57.1,23.6 ; v2(57.15,26.2) 56.65,26.7 51.7,26.7 v2(50.5,25.5)
EPD_SW: length 6.8
  Top Layer w0.35: L1.2 68.1,36.77 D1.2 69.2,38.7 C11.1
  Top Layer w0.4: L1.2 Q1.3
EPD_VCOM: length 12.2
  Top Layer w0.15: v1(50.4,39.2) 54.15,38.91 J2.24 ; 56.3,43.4 55.7,43.4 v2(54.9,42.6)
  Bottom Layer w0.15: v2(54.9,42.6) 51.7,39.4 50.6,39.4
EPD_VDD: length 22.2
  Top Layer w0.2: 53.02,34.81 54.15,34.41 55.22,34.41
  Top Layer w0.25: 63.9,36.8 v2(61.2,36.8) ; 63.75,32.05 62.7,32.3 61.15,32.3 61.15,31.4
  Top Layer w0.35: U4.5 63.75,32.05 C10.1
  Top Layer w0.45: C10.1 63.6,34.93 L1.1
  Bottom Layer w0.25: v2(61.2,36.8) 59.1,34.7 v2(53.3,34.7)
EPD_VDDL: length 0.6
  Top Layer w0.15: 55.8,28.9 56,28.9 56.3,28.6
EPD_VGH: length 24
  Top Layer w0.15: 52.4,37.16 54.15,37.41 55.22,37.41 ; 70.5,42.5 70.8,42.2 v2(71.1,42.2)
  Bottom Layer w0.15: v2(52.7,37.15) 53.35,37.8 53.4,37.8 53.45,37.85 53.5,37.85 53.55,37.9 53.6,37.9 53.7,38 58,38 58.05,38.05 58.1,38.05 58.15,38.1 58.2,38.1 62.25,42.15 64.45,42.15 ; 64.5,42.2 v2(71.1,42.2)
EPD_VGL: length 34.3
  Top Layer w0.15: v2(62.7,43.2) 63.7,44.2 67.4,44.2 67.9,43.7 75.6,43.7 ; 53.45,38.35 54.65,38.35 ; v2(55.7,42.4) 56.3,42.4
  Top Layer w0.35: D3.2 77.6,41.8 C13.1
  Bottom Layer w0.15: v2(62.7,43.2) 57.9,38.4 v2(53.2,38.4) ; 56.6,41.5 v2(55.7,42.4) ; 58.75,39.35 56.65,41.45
EPD_VPH: length 8.9
  Top Layer w0.3: C12.1 64.2,42.9 R16.1
  Top Layer w0.4: C12.1 64.2,39.2 D1.1
EPD_VSNH: length 16.7
  Top Layer w0.15: 50.1,37.5 48.4,39.2 51,41.8 55.6,41.8 56.3,41.1 ; 50.4,37.5 54.15,37.91 J2.22 ; 50.15,37.45 50.35,37.45
EPD_VSNL1: length 0.6
  Top Layer w0.15: 56.3,35.7 56.1,35.9 55.8,35.9
EPD_VSNL2: length 0.5
  Top Layer w0.15: 55.8,36.4 56.3,36.4
EPD_VSPH: length 16.5
  Top Layer w0.15: 56.3,39.3 56,39.6 v2(53.6,39.6) ; 54.7,36.9 53.3,36.9 52.8,36.4 49.8,36.4 v2(49.5,36.1)
  Bottom Layer w0.15: 49.4,36 48.6,36 48.3,36.3 48.3,36.9 48.7,37.3 51.2,37.3 53.5,39.6
EPD_VSPL1: length 0.5
  Top Layer w0.15: 55.8,29.4 56.3,29.4
EPD_VSPL2: length 36.7
  Top Layer w0.15: v2(52.4,35.7) 52.8,35.3 53.6,35.3 54,34.9 54.7,34.9 ; 60.4,42.8 60.4,32.8 59.9,32.3 57.9,32.3 57.6,32.6
  Bottom Layer w0.15: v2(60.3,42.9) 60,43.2 54.6,43.2 51.2,39.8 50.1,39.8 47.9,37.6 47.9,36.1 48.4,35.6 49.2,35.6 49.2,35.5 52.2,35.5
KEY_NEXT_N: length 25.1
  Top Layer w0.15: R11.2 67.65,7.5 66.55,7.57 ; v2(56.5,7) 56.5,8 55.1,9.4 52.8,9.4 52.4,9 ; v2(65.7,7.1) 66,7.4 66.3,7.4
  Top Layer w0.2: SW2.1 SW2.2
  Bottom Layer w0.15: v2(56.5,7) 56.5,6.6 57,6.1 57.6,6.1 58,6.5 60.6,6.5 61.2,7.1 v2(65.7,7.1)
KEY_OK_N: length 111
  Top Layer w0.15: R12.2 v1(67.65,9.3) ; v2(76.3,36.9) 76.3,40.2 v2(75.9,40.6) ; v2(64.7,8.3) 64.7,8.05 ; v2(65.45,24.1) 65.45,24.9 66.6,26.05 v2(66.6,26.6) ; U1.5 64.75,8 ; v2(40.7,16) 40.7,15.25 ; v2(65.45,21.5) 66.25,20.7 v2(67.1,20.7)
  Top Layer w0.2: 40,15.15 36.9,15.15 ; 40,15.15 43.1,15.15 ; 40,15.15 40,15.05
  Bottom Layer w0.15: v2(76.3,36.9) 76.3,36.25 66.65,26.6 ; 66.9,20.5 66.9,15.4 63.4,11.9 63.4,10.6 64.55,9.45 67.4,9.45 ; 40.3,24.95 41.2,25.85 41.2,33.4 52.8,45 71.5,45 v2(75.9,40.6) ; 64.7,9.4 v2(64.7,8.3) ; v2(65.45,21.5) v2(65.45,24.1) ; 40.35,24.9 40.35,16.45 ; 40.3,16.4 v2(40.7,16)
KEY_PREV_N: length 33.9
  Top Layer w0.15: v2(60,7.5) 64.35,7.5 65.7,6.15 66.3,6.15 ; R10.2 67.9,5.7 67.65,6 66.55,5.97 ; v2(50.15,8.55) 46.55,4.95 44,4.95
  Top Layer w0.2: SW1.1 SW1.2
  Bottom Layer w0.15: v2(60,7.5) 57,7.5 55.15,9.35 50.95,9.35 v2(50.15,8.55)
NFC1_TBD: length 604.8
  Top Layer w0.2: 58.15,5.57 v2(59.05,5.65) ; 58.15,4.77 v2(59.05,4.65)
  Top Layer w0.25: v3(33.8,28.9) 33.7,28.4 v4(30.3,28.4) ; C24.1 v2(54.8,3.85) ; C23.1 v2(54.8,7.95)
  Bottom Layer w0.25: v3(33.8,28.9) NOREF#4.NFC2 36.7,27.4 36.7,19.1 47.9,7.9 54.8,7.9 v2(54.8,7.95) 56.1,5.57 v2(59.05,5.65) ; v4(30.3,28.4) 30.9,28.4 30.9,43.77 29.87,44.8 6.03,44.8 5,43.77 5,22.23 6.03,21.2 29.87,21.2 30.9,22.23 30.9,27.9 31.4,27.9 31.4,43.98 30.08,45.3 5.82,45.3 4.5,43.98 4.5,22.02 5.82,20.7 30.08,20.7 31.4,22.02 31.4,27.4 31.9,27.4 31.9,44.19 30.29,45.8 5.61,45.8 4,44.19 4,21.81 5.61,20.2 30.29,20.2 31.9,21.81 31.9,26.9 32.4,26.9 32.4,44.39 30.49,46.3 5.41,46.3 3.5,44.39 3.5,21.61 5.41,19.7 30.49,19.7 32.4,21.61 32.4,26.4 32.9,26.4 32.9,44.6 30.7,46.8 5.2,46.8 3,44.6 3,21.4 5.2,19.2 30.7,19.2 32.9,21.4 32.9,25.9 NOREF#7.NFC1 35.95,25.15 35.95,18.85 47.65,7.15 53.7,7.15 53.7,5.2 v2(54.8,3.85) 55.24,4.1 55.9,4.77 v2(59.05,4.65)
NRESET: length 52.1
  Top Layer w0.15: v2(62.6,21.1) 65,23.5 65.7,23.5 66.5,24.3 66.5,25.1 67.2,25.8 67.2,26.9 72.9,32.6 v2(74.5,32.6) ; 58.15,11.17 v1(59.05,11)
  Bottom Layer w0.15: 75.5,47.1 76.5,47.1 80.2,43.4 80.2,37.8 75,32.6 v2(74.5,32.6) ; 62.5,21.1 61.2,19.8 61.2,18.5 63.5,16.2 63.5,14.4 60.2,11.1 59.3,11.1
SWDCLK: length 78.2
  Top Layer w0.15: v2(45.4,19.7) 45.4,20.5 43.9,22 v2(43.9,25.9) ; v2(43.9,10) 43.9,10.3 v2(45.9,12.3) ; v2(44.7,27.1) 44.7,36.8 54.9,47 v2(68.6,47) ; v2(50.1,6.5) 52.2,8.6 54.7,8.6 ; 57,5.35 56.9,5.45 56.85,5.45 56.8,5.5 56.75,5.5 55.5,6.75 55.5,7.5 55.4,7.6 55.4,8.15 55.35,8.2 55.35,8.25 55.3,8.3 55.3,8.35 54.9,8.75 ; 54.76,8.64 54.84,8.7
  Bottom Layer w0.15: v2(68.6,47) 69.3,47 69.4,47.1 ; v2(45.9,12.3) 45.5,12.3 42.1,15.7 42.1,16.9 44.9,19.7 v2(45.4,19.7) ; v2(43.9,10) 47.2,6.7 49.9,6.7 ; v2(44.7,27.1) 43.7,26.1
SWDIO: length 68.3
  Top Layer w0.15: v2(71.2,8.8) v2(71.2,7.4) ; v2(78.8,39.9) 80.4,38.3 80.4,36.9 v2(76.1,32.6) ; v2(68.4,24.1) v2(69.4,23.1) ; v1(57.3,6.75) 57.3,6.15
  Bottom Layer w0.15: v2(69.4,23.1) 69.4,21.6 67.3,19.5 67.3,14.5 68.7,13.1 68.7,12.1 67.5,10.9 67.5,10.1 67.7,9.9 70.1,9.9 v2(71.2,8.8) ; v2(78.8,39.9) 78.8,41.2 72.9,47.1 ; v2(76.1,32.6) 75.5,32.6 69,26.1 69,24.7 v2(68.4,24.1) ; 57.4,7 57.5,6.9 60.3,6.9 61.1,7.7 70.9,7.7 v2(71.2,7.4)
SYS: length 23.2
  Top Layer w0.15: U3.1 53.83,15.4 55.73,15.4 U3.3
  Top Layer w0.2: 45.67,17.4 46.4,17.4 C2.1 46.2,15.5 v1(45.8,13.6)
  Top Layer w0.35: C4.1 U3.1
  Bottom Layer w0.35: v2(53.9,15.6) 53.9,13.2 52.6,11.9 47.5,11.9 46,13.4
USB_CC1: length 9.9
  Top Layer w0.2: 67.05,19.7 69.3,19.7 69.9,20.3 U6.1 71.15,20.75 74.05,23.65 J1.A5
USB_CC2: length 14
  Top Layer w0.2: 67.05,22.5 69.3,22.5 69.9,21.9 U6.2 v1(70.9,21.7) ; J1.B5 74.1,26.65 73.3,27.45 v2(72.2,27.45)
  Bottom Layer w0.2: v2(72.2,27.45) 71.8,27.05 71.8,22.6 v1(70.9,21.7)
USB_DM_CONN: length 38.9
  Top Layer w0.2: v2(67.1,24.75) U5.2 70.3,23.35 72.9,23.35 73.7,24.15 J1.B7 ; v2(52.7,14.6) R4.1 ; 75.05,25.15 v2(72.6,25.15)
  Bottom Layer w0.2: v2(72.6,25.15) 72.7,25.05 v2(72.7,23.35) ; v2(52.7,14.6) 52.3,15 52.3,24.05 53,24.75 v2(67.1,24.75)
USB_DM_MCU: length 2.3
  Top Layer w0.2: 55.25,14.6 55.9,14.6 56.53,13.97 57.25,13.97
USB_DP_CONN: length 44.3
  Top Layer w0.2: 75.05,25.65 74.2,25.65 73.8,26.05 71.7,26.05 ; 71.7,26.05 71.7,24.15 72.6,24.15 73.1,24.65 J1.A6 ; 71.7,26.05 71.7,26.9 69.6,26.9 68.9,25.45 v2(67.8,25.45) ; v2(52.7,13.1) R3.1
  Bottom Layer w0.2: v2(52.7,13.1) 51.6,14.2 51.6,24.75 52.3,25.45 v2(67.8,25.45)
USB_DP_MCU: length 2
  Top Layer w0.2: 55.25,13.1 57.25,13.17
USB_VBUS: length 52.7
  Top Layer w0.2: 43.57,17.4 43.57,16.4 43.8,16.4
  Top Layer w0.3: J1.A4B9 74.15,22.5 73.5,21.85 v2(73.5,20) ; 57.9,14.97 57.9,16.1 C1.1 v1(58.8,16.75) ; J1.B4A9 74.2,27.3 73.55,27.95 v2(73.55,28.4)
  Top Layer w0.4: v2(43.6,16.5) 43.8,16.4 C8.1
  Top Layer w0.6: v2(49.9,18.21) 56.66,18.21 57,18.55 72.05,18.55 v2(73.5,20)
  Bottom Layer w0.3: v1(58.8,16.75) v2(58.8,18.55)
  Bottom Layer w0.5: v2(73.55,28.4) 73.8,28.15 73.8,20.3 v2(73.5,20)
  Bottom Layer w0.6: v2(43.6,16.5) 44,16.6 48.4,16.6 v2(49.9,18.21)

## Copper pours and planes (outline as drawn; the poured copper is in the pictures)
GND on Top Layer: 35.91,0.31 35.71,0.51 35.71,15.7 35.61,16.09 35.3,16.41 34.9,16.51 0.51,16.51 0.31,16.71 0.31,47.79 0.32,47.97 0.34,48.13 0.38,48.29 0.44,48.45 0.51,48.6 0.59,48.74 0.69,48.87 0.81,48.99 0.93,49.11 1.06,49.21 1.2,49.29 1.35,49.36 1.51,49.42 1.67,49.46 1.83,49.48 2.01,49.49 79.79,49.49 79.97,49.48 80.13,49.46 80.29,49.42 80.45,49.36 80.6,49.29 80.74,49.21 80.87,49.11 80.99,48.99 81.11,48.87 81.21,48.74 81.29,48.6 81.36,48.45 81.42,48.29 81.46,48.13 81.48,47.97 81.49,47.79 81.49,29.83 76.06,29.83 75.29,29.05 75.29,20.75 76.06,19.97 81.49,19.97 81.49,2.01 81.48,1.83 81.46,1.67 81.42,1.51 81.36,1.35 81.29,1.2 81.21,1.06 81.11,0.93 80.99,0.81 80.87,0.69 80.74,0.59 80.6,0.51 80.45,0.44 80.29,0.38 80.13,0.34 79.97,0.32 79.79,0.31
GND on Bottom Layer: 35.91,0.31 35.71,0.51 35.71,15.7 35.61,16.09 35.3,16.41 34.9,16.51 0.51,16.51 0.31,16.71 0.31,47.79 0.32,47.97 0.34,48.13 0.38,48.29 0.44,48.45 0.51,48.6 0.59,48.74 0.69,48.87 0.81,48.99 0.93,49.11 1.06,49.21 1.2,49.29 1.35,49.36 1.51,49.42 1.67,49.46 1.83,49.48 2.01,49.49 79.79,49.49 79.97,49.48 80.13,49.46 80.29,49.42 80.45,49.36 80.6,49.29 80.74,49.21 80.87,49.11 80.99,48.99 81.11,48.87 81.21,48.74 81.29,48.6 81.36,48.45 81.42,48.29 81.46,48.13 81.48,47.97 81.49,47.79 81.49,29.83 76.06,29.83 75.29,29.05 75.29,20.75 76.06,19.97 81.49,19.97 81.49,2.01 81.48,1.83 81.46,1.67 81.42,1.51 81.36,1.35 81.29,1.2 81.21,1.06 81.11,0.93 80.99,0.81 80.87,0.69 80.74,0.59 80.6,0.51 80.45,0.44 80.29,0.38 80.13,0.34 79.97,0.32 79.79,0.31

## Text on the board
Bottom Silkscreen Layer: GND | 3V3 | CLK | DIO | RST
Document Layer: CLOSED USB CUTOUT / v4.60 R0.25 ASSUMED / FACTORY REVIEW OPEN | U1 ANTENNA / KEEP ALL COPPER OUT TO y=4.96 mm | J1 USB-C / RIGHT EDGE MIDDLE / PCB EDGE DATUM | BOARD REVIEW D - CONDITIONAL CANDIDATE | SCREEN GAUGE 37.42 x 31.9 mm / FPC NOT VERIFIED | 301030 RECEIVED / 3 mm USER REPORT / CAVITY 32.5 x 14 x 3.2 mm | KEY CENTRES: (41.1,4.5) / (41.1,14.4) / (49.6,8.8) mm | FPC FOLD AND INSERTION ENVELOPE NOT VERIFIED | R2 D - USB EDGE / POWER REVIEW OPEN - NOT FOR FABRICATION
Top Silkscreen Layer: B+ | B-
